# Altium project CM5_RP2040_MZM.PrjPcb (part 2 of 3)

## Sheet CM5_Boot_USB.SchDoc: 05 - CM5: boot, USB, UART, I2C e ventilacao
size A3; Project: CM5 Photonic Bias Controller; DocumentRev: R5; ProjectRev: R5; Version: Rev R6; SheetNumber: 6; SheetTotal: 17; Author: Carlos Renan; SCH_SCALE: N/A; Address1: UFCG; Address2: Referencia: VIRTUS CC; Address3: Campina Grande - PB; ProjectName: Controle automatico de BIAS para MZM/IQ - Projeto 3; DocumentName: CM5_Boot_USB.SchDoc
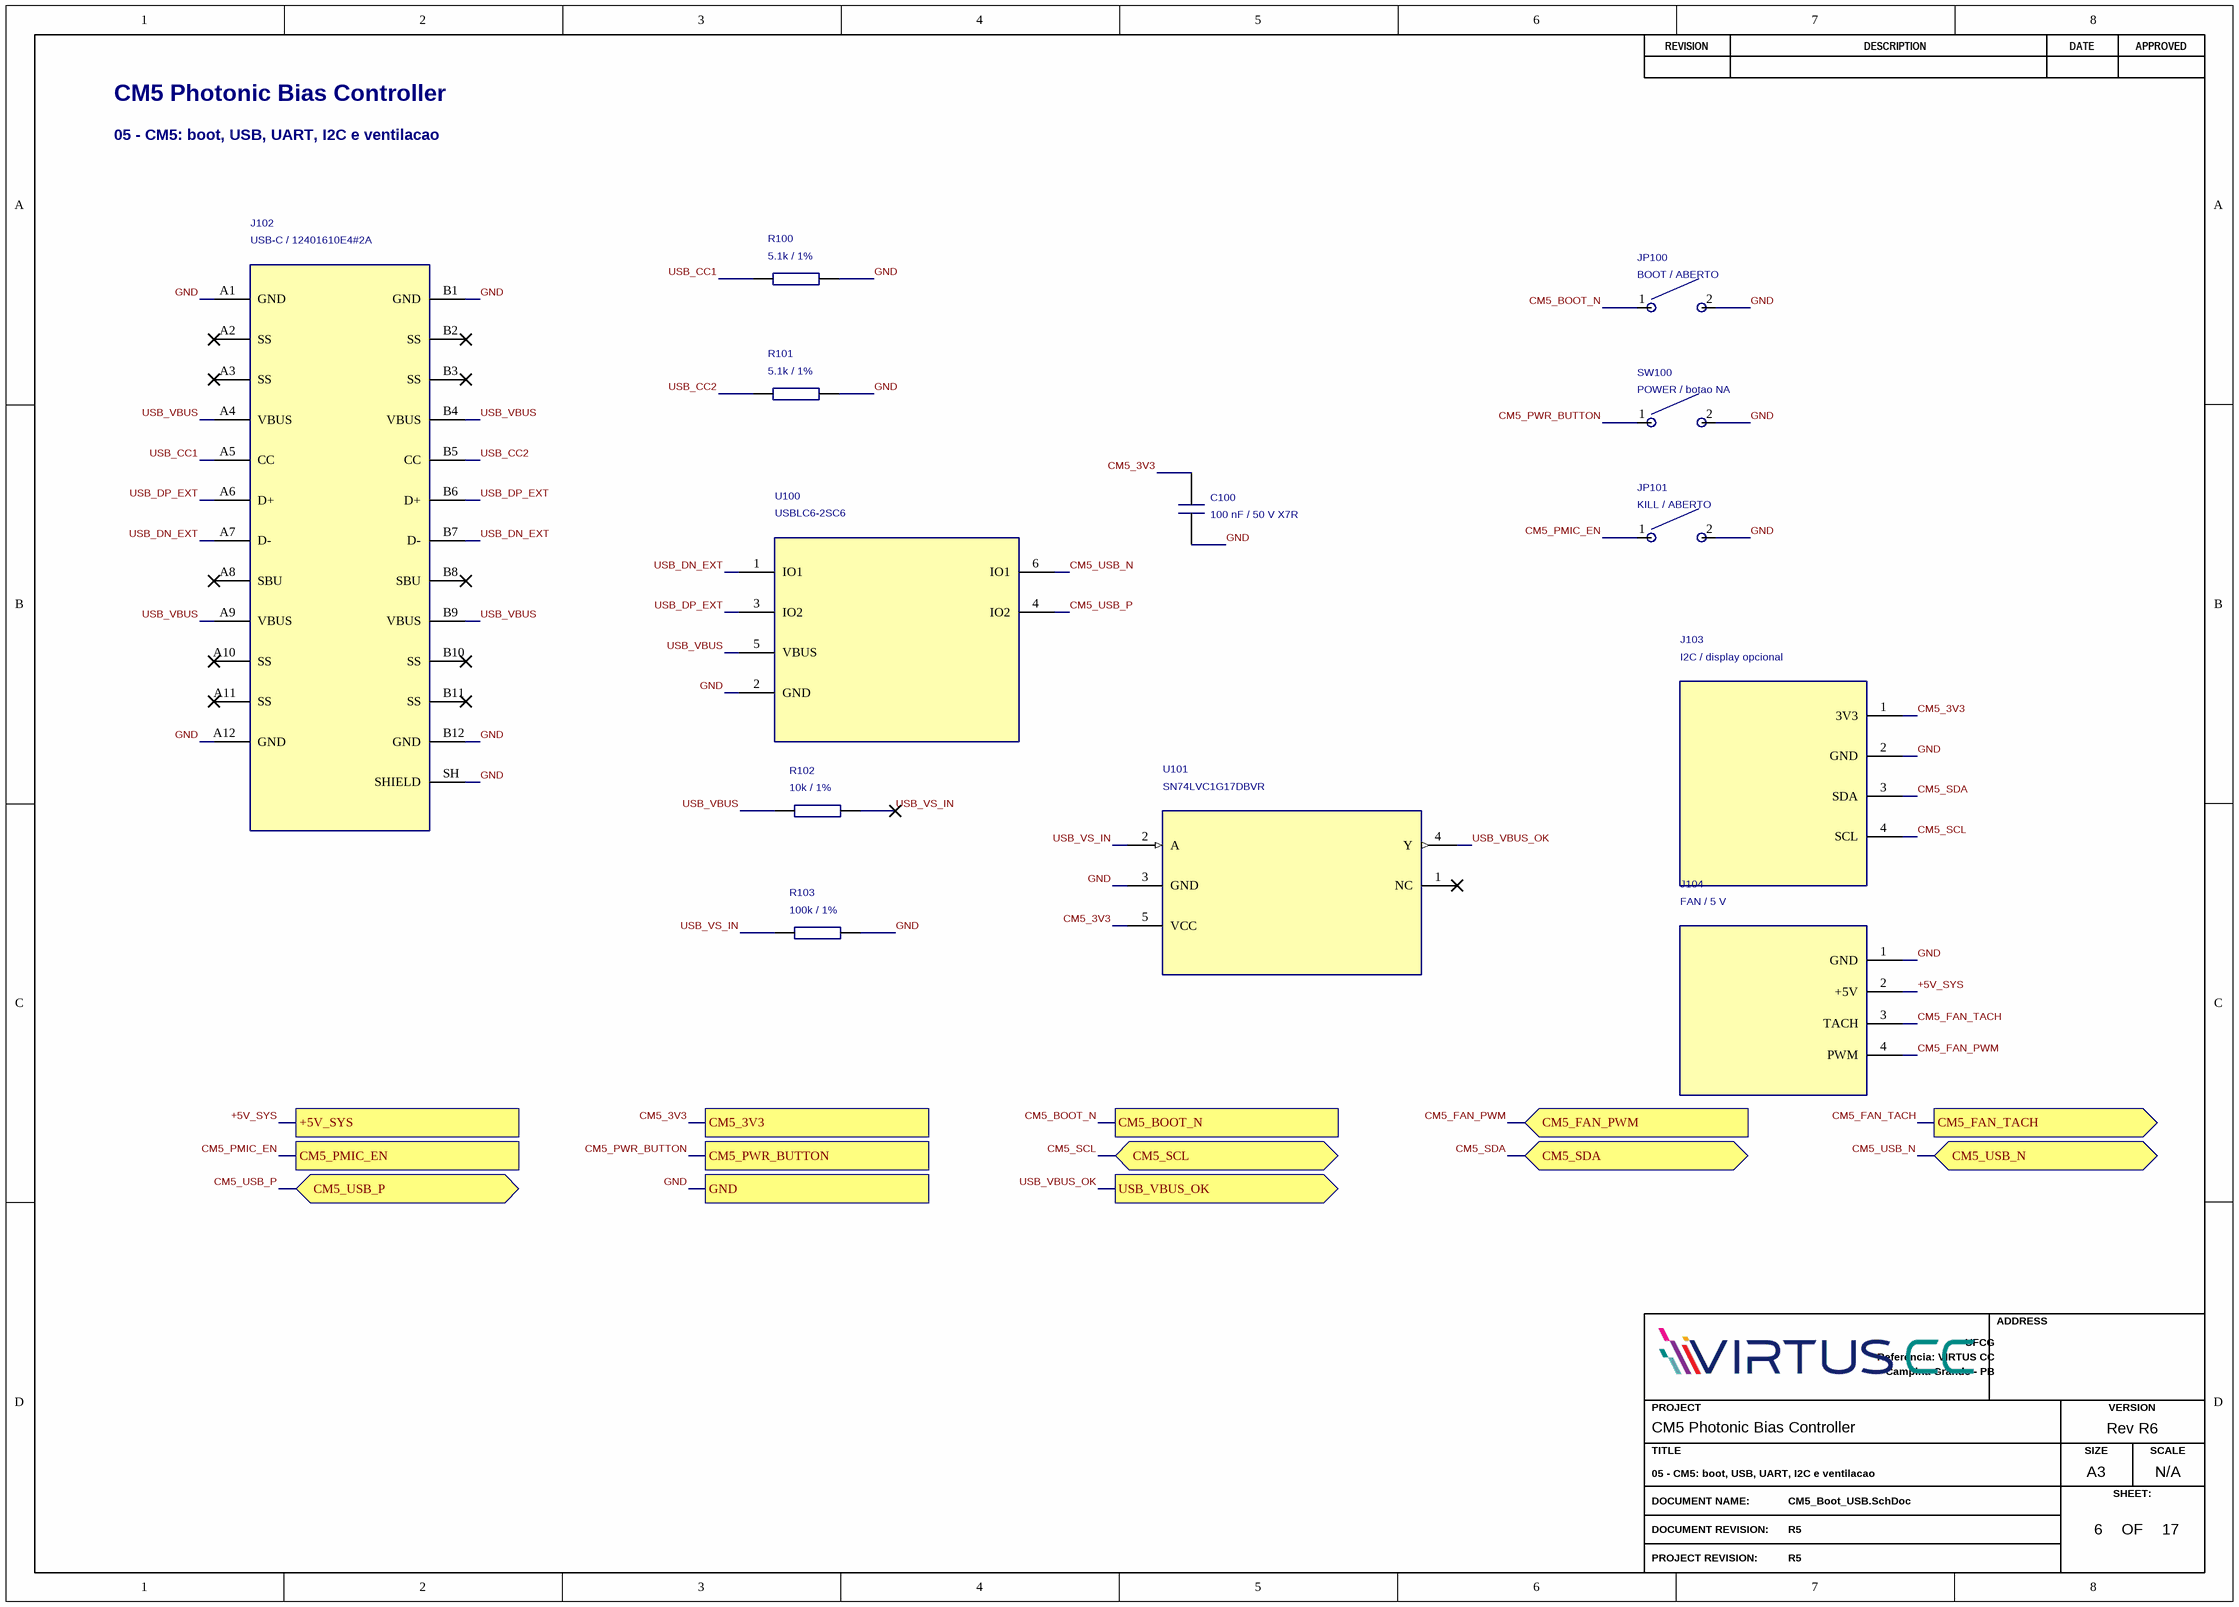
[diagram p8: CM5_Boot_USB.SchDoc]

### Parts
C100  100 nF / 50 V X7R  [C0805]
J102  USB-C / 12401610E4#2A  [USB_C_12401610]
J103  I2C / display opcional  [HDR_1X04_P254]
J104  FAN / 5 V  [HDR_1X04_P254]
JP100  BOOT / ABERTO  [HDR_1X02_P254]
JP101  KILL / ABERTO  [HDR_1X02_P254]
R100  5.1k / 1%  [R-0603]
R101  5.1k / 1%  [R-0603]
R102  10k / 1%  [R-0603]
R103  100k / 1%  [R-0603]
SW100  POWER / botao NA  [SW_TL3305A]
U100  USBLC6-2SC6  [SOT26]
U101  SN74LVC1G17DBVR  [FP-C04-091-OT-MFG]

### Ports
+5V_SYS, CM5_3V3, CM5_BOOT_N, CM5_FAN_PWM (in), CM5_FAN_TACH (out), CM5_PMIC_EN, CM5_PWR_BUTTON, CM5_SCL (bidir), CM5_SDA (bidir), CM5_USB_N (bidir), CM5_USB_P (bidir), GND, USB_VBUS_OK (out)

### Nets
GND: C100.2 J102.A1(GND) J102.A12(GND) J102.B1(GND) J102.B12(GND) J102.SH(SHIELD) J103.2(GND) J104.1(GND) JP100.2 JP101.2 R100.2 R101.2 R103.2 SW100.2 U100.2(GND) U101.3(GND) ; port GND
+5V_SYS: J104.2(+5V) ; port +5V_SYS
CM5_3V3: C100.1 J103.1(3V3) U101.5(VCC) ; port CM5_3V3
CM5_BOOT_N: JP100.1 ; port CM5_BOOT_N
CM5_FAN_PWM: J104.4(PWM) ; port CM5_FAN_PWM
CM5_FAN_TACH: J104.3(TACH) ; port CM5_FAN_TACH
CM5_PMIC_EN: JP101.1 ; port CM5_PMIC_EN
CM5_PWR_BUTTON: SW100.1 ; port CM5_PWR_BUTTON
CM5_SCL: J103.4(SCL) ; port CM5_SCL
CM5_SDA: J103.3(SDA) ; port CM5_SDA
CM5_USB_N: U100.6(IO1) ; port CM5_USB_N
CM5_USB_P: U100.4(IO2) ; port CM5_USB_P
USB_CC1: J102.A5(CC) R100.1
USB_CC2: J102.B5(CC) R101.1
USB_DN_EXT: J102.A7(D-) J102.B7(D-) U100.1(IO1)
USB_DP_EXT: J102.A6(D+) J102.B6(D+) U100.3(IO2)
USB_VBUS: J102.A4(VBUS) J102.A9(VBUS) J102.B4(VBUS) J102.B9(VBUS) R102.1 U100.5(VBUS)
USB_VBUS_OK: U101.4(Y) ; port USB_VBUS_OK
USB_VS_IN: R102.2 R103.1 U101.2(A)

Not connected (* = marked no-connect by the designer): J102 A2(SS)* A3(SS)* A8(SBU)* A10(SS)* A11(SS)* B2(SS)* B3(SS)* B8(SBU)* B10(SS)* B11(SS)*; U101 1(NC)*

### Notes on the sheet
- CM5 Photonic Bias Controller
- 05 - CM5: boot, USB, UART, I2C e ventilacao
- REVISION
- DESCRIPTION
- DATE
- APPROVED
- ADDRESS
- PROJECT
- VERSION
- TITLE
- A3
- SIZE
- SCALE
- DOCUMENT NAME:
- DOCUMENT REVISION:
- OF
- SHEET:
- PROJECT REVISION:

### Library data of the parts
C100 = 100 nF: as C202 on sheet Power_Input_5V; Manufacturer 1: KEMET; Manufacturer Part Number 1: C0805C104K5RACTU; Supplier 1: DigiKey; Supplier URL 1: https://www.digikey.com.br/pt/products/result?keywords=C0805C104K5RACTU; Supplier 2: Mouser; Supplier URL 2: https://br.mouser.com/c/?q=C0805C104K5RACTU; Datasheet: https://www.yageogroup.com/download/specsheet/C0805C104K5RACTU
J102 = USB-C: Manufacturer: Amphenol Communications Solutions; Review: 24 contatos; SuperSpeed e SBU NC. Somente USB2; os quatro pads da carcaca sao SH.; Procurement Status: Busca por MPN; SKU e disponibilidade a confirmar; BOM Purchase: Yes; Manufacturer Part Number: 12401610E4#2A; Manufacturer 1: Amphenol Communications Solutions; Manufacturer Part Number 1: 12401610E4#2A; Supplier 1: DigiKey; Supplier URL 1: https://www.digikey.com.br/pt/products/result?keywords=12401610E4%232A; Supplier 2: Mouser; Supplier Part Number 2: 523-12401610E4#2A; Supplier URL 2: https://br.mouser.com/c/?q=12401610E4%232A; Datasheet: https://cdn.amphenol-cs.com/media/wysiwyg/files/drawing/c12401610_c.pdf
J103 = I2C: Manufacturer: Wurth Elektronik; Manufacturer Part Number: 61300411121; Review: Header reto 1x4 sem chave. Conferir sequencia de pinos do cabo do fan; nao pressupor conector PC padrao.; Procurement Status: Busca por MPN; SKU e disponibilidade a confirmar; BOM Purchase: Yes; Manufacturer 1: Wurth Elektronik; Manufacturer Part Number 1: 61300411121; Supplier 1: DigiKey; Supplier URL 1: https://www.digikey.com.br/pt/products/result?keywords=61300411121; Supplier 2: Mouser; Supplier URL 2: https://br.mouser.com/c/?q=61300411121; Datasheet: https://www.we-online.com/components/products/datasheet/61300411121.pdf
J104 = FAN: Manufacturer: Wurth Elektronik; Manufacturer Part Number: 61300411121; Review: Header reto 1x4 sem chave. Conferir sequencia de pinos do cabo do fan; nao pressupor conector PC padrao.; Procurement Status: Busca por MPN; SKU e disponibilidade a confirmar; BOM Purchase: Yes; Manufacturer 1: Wurth Elektronik; Manufacturer Part Number 1: 61300411121; Supplier 1: DigiKey; Supplier URL 1: https://www.digikey.com.br/pt/products/result?keywords=61300411121; Supplier 2: Mouser; Supplier URL 2: https://br.mouser.com/c/?q=61300411121; Datasheet: https://www.we-online.com/components/products/datasheet/61300411121.pdf
JP100 = BOOT: Manufacturer: Wurth Elektronik; Manufacturer Part Number: 61300211121; Review: Header 1x2; shunt removivel listado como acessorio. SW1000 inicia aberto.; Procurement Status: Busca por MPN; SKU e disponibilidade a confirmar; BOM Purchase: Yes; Manufacturer 1: Wurth Elektronik; Manufacturer Part Number 1: 61300211121; Supplier 1: DigiKey; Supplier URL 1: https://www.digikey.com.br/pt/products/result?keywords=61300211121; Supplier 2: Mouser; Supplier URL 2: https://br.mouser.com/c/?q=61300211121; Datasheet: https://www.we-online.com/components/products/datasheet/61300211121.pdf
JP101 = KILL: Manufacturer: Wurth Elektronik; Manufacturer Part Number: 61300211121; Review: Header 1x2; shunt removivel listado como acessorio. SW1000 inicia aberto.; Procurement Status: Busca por MPN; SKU e disponibilidade a confirmar; BOM Purchase: Yes; Manufacturer 1: Wurth Elektronik; Manufacturer Part Number 1: 61300211121; Supplier 1: DigiKey; Supplier URL 1: https://www.digikey.com.br/pt/products/result?keywords=61300211121; Supplier 2: Mouser; Supplier URL 2: https://br.mouser.com/c/?q=61300211121; Datasheet: https://www.we-online.com/components/products/datasheet/61300211121.pdf
R100 R101 = 5.1k: Manufacturer: YAGEO; Manufacturer Part Number: RC0603FR-075K1L; Procurement Status: Busca por MPN; SKU e disponibilidade a confirmar; BOM Purchase: Yes; Manufacturer 1: YAGEO; Manufacturer Part Number 1: RC0603FR-075K1L; Supplier 1: DigiKey; Supplier URL 1: https://www.digikey.com.br/pt/products/result?keywords=RC0603FR-075K1L; Supplier 2: Mouser; Supplier URL 2: https://br.mouser.com/c/?q=RC0603FR-075K1L; Datasheet: https://www.yageo.com/en/Product/Index/rchip
R102 = 10k: Manufacturer: YAGEO; Manufacturer Part Number: RC0603FR-0710KL; Procurement Status: Busca por MPN; SKU e disponibilidade a confirmar; BOM Purchase: Yes; Manufacturer 1: YAGEO; Manufacturer Part Number 1: RC0603FR-0710KL; Supplier 1: DigiKey; Supplier URL 1: https://www.digikey.com.br/pt/products/result?keywords=RC0603FR-0710KL; Supplier 2: Mouser; Supplier URL 2: https://br.mouser.com/c/?q=RC0603FR-0710KL; Datasheet: https://www.yageo.com/en/Product/Index/rchip
R103 = 100k: Manufacturer: YAGEO; Manufacturer Part Number: RC0603FR-07100KL; Procurement Status: Busca por MPN; SKU e disponibilidade a confirmar; BOM Purchase: Yes; Manufacturer 1: YAGEO; Manufacturer Part Number 1: RC0603FR-07100KL; Supplier 1: DigiKey; Supplier URL 1: https://www.digikey.com.br/pt/products/result?keywords=RC0603FR-07100KL; Supplier 2: Mouser; Supplier URL 2: https://br.mouser.com/c/?q=RC0603FR-07100KL; Datasheet: https://www.yageo.com/en/Product/Index/rchip
SW100 = POWER: Manufacturer: E-Switch; Manufacturer Part Number: TL3305AF160QG; Review: Botao normalmente aberto; quatro pads fisicos, dois numeros eletricos repetidos.; Procurement Status: Busca por MPN; SKU e disponibilidade a confirmar; BOM Purchase: Yes; Manufacturer 1: E-Switch; Manufacturer Part Number 1: TL3305AF160QG; Supplier 1: DigiKey; Supplier URL 1: https://www.digikey.com.br/pt/products/result?keywords=TL3305AF160QG; Supplier 2: Mouser; Supplier URL 2: https://br.mouser.com/c/?q=TL3305AF160QG; Datasheet: https://www.e-switch.com/product-catalog/tl3305-series-tact-switch/
U100 = USBLC6-2SC6: Manufacturer: STMicroelectronics; Procurement Status: Busca por MPN; SKU e disponibilidade a confirmar; BOM Purchase: Yes; Manufacturer Part Number: USBLC6-2SC6; Manufacturer 1: STMicroelectronics; Manufacturer Part Number 1: USBLC6-2SC6; Supplier 1: DigiKey; Supplier URL 1: https://www.digikey.com.br/pt/products/result?keywords=USBLC6-2SC6; Supplier 2: Mouser; Supplier URL 2: https://br.mouser.com/c/?q=USBLC6-2SC6; Datasheet: https://www.st.com/resource/en/datasheet/usblc6-2.pdf
U101 = SN74LVC1G17DBVR: Manufacturer: Texas Instruments; Procurement Status: Busca por MPN; SKU e disponibilidade a confirmar; BOM Purchase: Yes; Manufacturer Part Number: SN74LVC1G17DBVR; Manufacturer 1: Texas Instruments; Manufacturer Part Number 1: SN74LVC1G17DBVR; Supplier 1: DigiKey; Supplier URL 1: https://www.digikey.com.br/pt/products/result?keywords=SN74LVC1G17DBVR; Supplier 2: Mouser; Supplier URL 2: https://br.mouser.com/c/?q=SN74LVC1G17DBVR; Datasheet: https://www.ti.com/lit/ds/symlink/sn74lvc1g17.pdf

## Sheet MCU_RP2040.SchDoc: 06 - Controlador deterministico RP2040
size A3; Project: CM5 Photonic Bias Controller; DocumentRev: R5; ProjectRev: R5; Version: Rev R6; SheetNumber: 7; SheetTotal: 17; Author: Carlos Renan; SCH_SCALE: N/A; Address1: UFCG; Address2: Referencia: VIRTUS CC; Address3: Campina Grande - PB; ProjectName: Controle automatico de BIAS para MZM/IQ - Projeto 3; DocumentName: MCU_RP2040.SchDoc
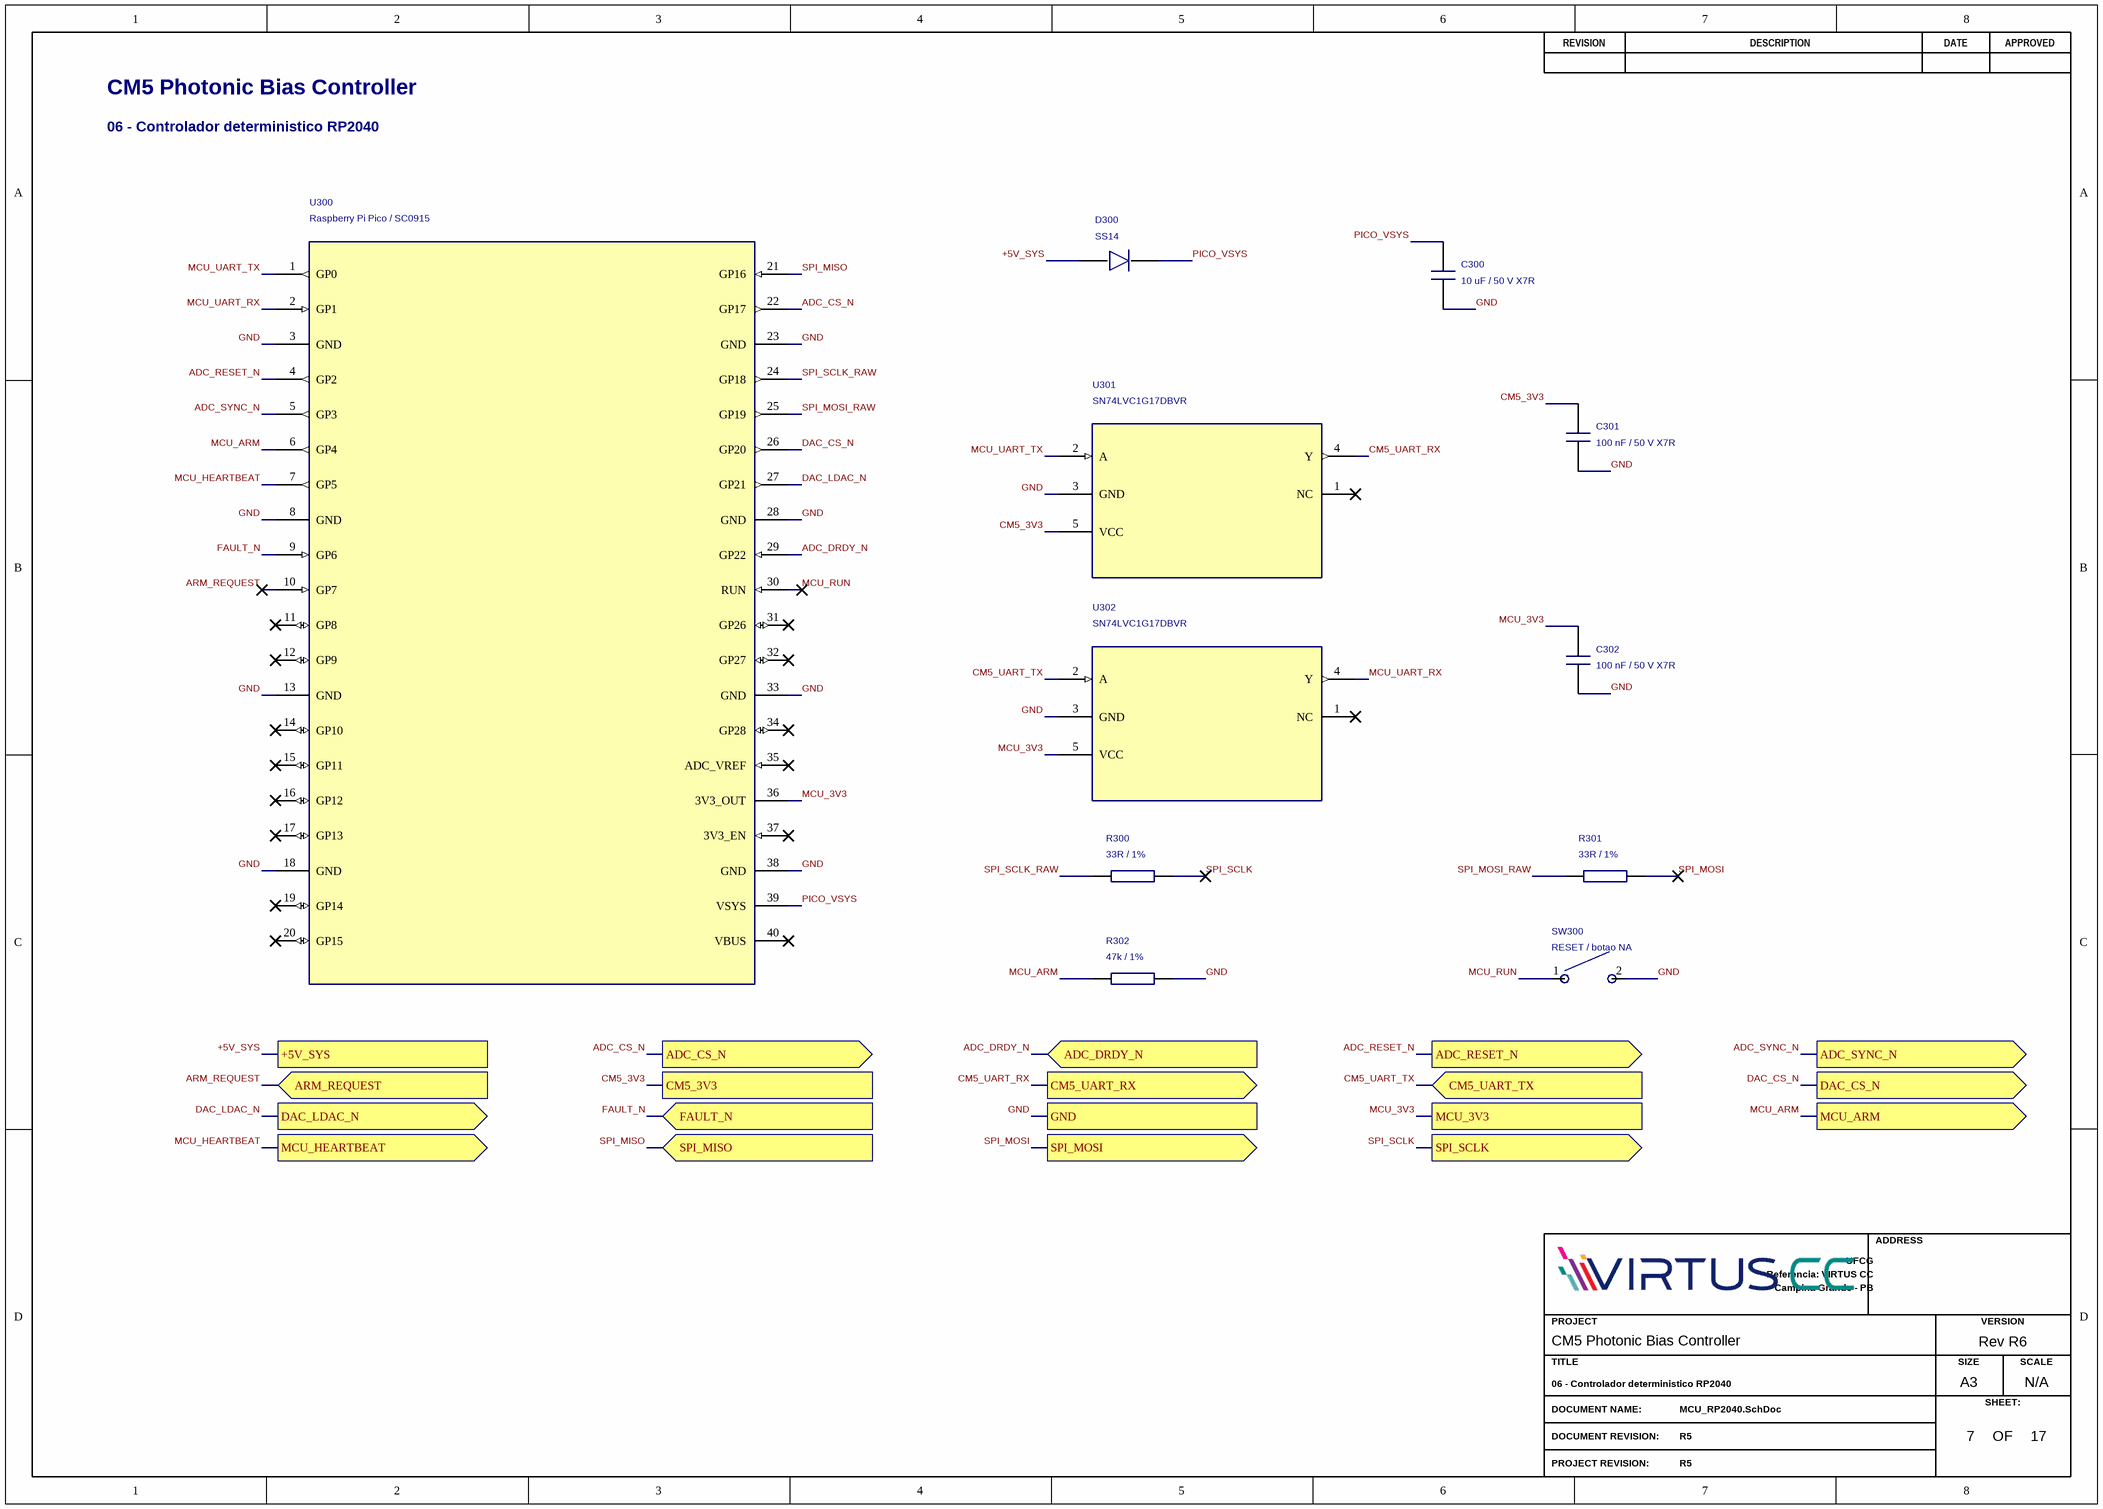
[diagram p9: MCU_RP2040.SchDoc]

### Parts
C300  10 uF / 50 V X7R  [C1210]
C301  100 nF / 50 V X7R  [C0805]
C302  100 nF / 50 V X7R  [C0805]
D300  SS14  [DO-214AC]
R300  33R / 1%  [R-0603]
R301  33R / 1%  [R-0603]
R302  47k / 1%  [R-0603]
SW300  RESET / botao NA  [SW_TL3305A]
U300  Raspberry Pi Pico / SC0915  [PICO_TH40]
U301  SN74LVC1G17DBVR  [FP-C04-091-OT-MFG]
U302  SN74LVC1G17DBVR  [FP-C04-091-OT-MFG]

### Ports
+5V_SYS, ADC_CS_N (out), ADC_DRDY_N (in), ADC_RESET_N (out), ADC_SYNC_N (out), ARM_REQUEST (in), CM5_3V3, CM5_UART_RX (out), CM5_UART_TX (in), DAC_CS_N (out), DAC_LDAC_N (out), FAULT_N (in), GND, MCU_3V3, MCU_ARM (out), MCU_HEARTBEAT (out), SPI_MISO (in), SPI_MOSI (out), SPI_SCLK (out)

### Nets
GND: C300.2 C301.2 C302.2 R302.2 SW300.2 U300.3(GND) U300.8(GND) U300.13(GND) U300.18(GND) U300.23(GND) U300.28(GND) U300.33(GND) U300.38(GND) U301.3(GND) U302.3(GND) ; port GND
+5V_SYS: D300.2(A) ; port +5V_SYS
ADC_CS_N: U300.22(GP17) ; port ADC_CS_N
ADC_DRDY_N: U300.29(GP22) ; port ADC_DRDY_N
ADC_RESET_N: U300.4(GP2) ; port ADC_RESET_N
ADC_SYNC_N: U300.5(GP3) ; port ADC_SYNC_N
ARM_REQUEST: U300.10(GP7) ; port ARM_REQUEST
CM5_3V3: C301.1 U301.5(VCC) ; port CM5_3V3
CM5_UART_RX: U301.4(Y) ; port CM5_UART_RX
CM5_UART_TX: U302.2(A) ; port CM5_UART_TX
DAC_CS_N: U300.26(GP20) ; port DAC_CS_N
DAC_LDAC_N: U300.27(GP21) ; port DAC_LDAC_N
FAULT_N: U300.9(GP6) ; port FAULT_N
MCU_3V3: C302.1 U300.36(3V3_OUT) U302.5(VCC) ; port MCU_3V3
MCU_ARM: R302.1 U300.6(GP4) ; port MCU_ARM
MCU_HEARTBEAT: U300.7(GP5) ; port MCU_HEARTBEAT
MCU_RUN: SW300.1 U300.30(RUN)
MCU_UART_RX: U300.2(GP1) U302.4(Y)
MCU_UART_TX: U300.1(GP0) U301.2(A)
PICO_VSYS: C300.1 D300.1(K) U300.39(VSYS)
SPI_MISO: U300.21(GP16) ; port SPI_MISO
SPI_MOSI: R301.2 ; port SPI_MOSI
SPI_MOSI_RAW: R301.1 U300.25(GP19)
SPI_SCLK: R300.2 ; port SPI_SCLK
SPI_SCLK_RAW: R300.1 U300.24(GP18)

Not connected (* = marked no-connect by the designer): U300 11(GP8)* 12(GP9)* 14(GP10)* 15(GP11)* 16(GP12)* 17(GP13)* 19(GP14)* 20(GP15)* 31(GP26)* 32(GP27)* 34(GP28)* 35(ADC_VREF)* 37(3V3_EN)* 40(VBUS)*; U301 1(NC)*; U302 1(NC)*

### Notes on the sheet
- CM5 Photonic Bias Controller
- 06 - Controlador deterministico RP2040
- REVISION
- DESCRIPTION
- DATE
- APPROVED
- ADDRESS
- PROJECT
- VERSION
- TITLE
- A3
- SIZE
- SCALE
- DOCUMENT NAME:
- DOCUMENT REVISION:
- OF
- SHEET:
- PROJECT REVISION:

### Library data of the parts
C300 = 10 uF: Manufacturer: KEMET; Manufacturer Part Number: C1210C106K5RACTU; Procurement Status: Busca por MPN; SKU e disponibilidade a confirmar; BOM Purchase: Yes; Manufacturer 1: KEMET; Manufacturer Part Number 1: C1210C106K5RACTU; Supplier 1: DigiKey; Supplier URL 1: https://www.digikey.com.br/pt/products/result?keywords=C1210C106K5RACTU; Supplier 2: Mouser; Supplier URL 2: https://br.mouser.com/c/?q=C1210C106K5RACTU; Datasheet: https://www.yageogroup.com/download/specsheet/C1210C106K5RACTU
C301 C302 = 100 nF: as C202 on sheet Power_Input_5V; Manufacturer 1: KEMET; Manufacturer Part Number 1: C0805C104K5RACTU; Supplier 1: DigiKey; Supplier URL 1: https://www.digikey.com.br/pt/products/result?keywords=C0805C104K5RACTU; Supplier 2: Mouser; Supplier URL 2: https://br.mouser.com/c/?q=C0805C104K5RACTU; Datasheet: https://www.yageogroup.com/download/specsheet/C0805C104K5RACTU
D300 = SS14: Manufacturer: Diodes Incorporated; Manufacturer Part Number: SS14-13-F; Procurement Status: Busca por MPN; SKU e disponibilidade a confirmar; BOM Purchase: Yes; Manufacturer 1: Diodes Incorporated; Manufacturer Part Number 1: SS14-13-F; Supplier 1: DigiKey; Supplier URL 1: https://www.digikey.com.br/pt/products/result?keywords=SS14-13-F; Supplier 2: Mouser; Supplier URL 2: https://br.mouser.com/c/?q=SS14-13-F; Datasheet: https://www.diodes.com/datasheet/download/SS12.pdf
R300 R301 = 33R: Manufacturer: YAGEO; Manufacturer Part Number: RC0603FR-0733RL; Procurement Status: Busca por MPN; SKU e disponibilidade a confirmar; BOM Purchase: Yes; Manufacturer 1: YAGEO; Manufacturer Part Number 1: RC0603FR-0733RL; Supplier 1: DigiKey; Supplier URL 1: https://www.digikey.com.br/pt/products/result?keywords=RC0603FR-0733RL; Supplier 2: Mouser; Supplier URL 2: https://br.mouser.com/c/?q=RC0603FR-0733RL; Datasheet: https://www.yageo.com/en/Product/Index/rchip
R302 = 47k: Manufacturer: YAGEO; Manufacturer Part Number: RC0603FR-0747KL; Procurement Status: Busca por MPN; SKU e disponibilidade a confirmar; BOM Purchase: Yes; Manufacturer 1: YAGEO; Manufacturer Part Number 1: RC0603FR-0747KL; Supplier 1: DigiKey; Supplier URL 1: https://www.digikey.com.br/pt/products/result?keywords=RC0603FR-0747KL; Supplier 2: Mouser; Supplier URL 2: https://br.mouser.com/c/?q=RC0603FR-0747KL; Datasheet: https://www.yageo.com/en/Product/Index/rchip
SW300 = RESET: Manufacturer: E-Switch; Manufacturer Part Number: TL3305AF160QG; Review: Botao normalmente aberto; quatro pads fisicos, dois numeros eletricos repetidos.; Procurement Status: Busca por MPN; SKU e disponibilidade a confirmar; BOM Purchase: Yes; Manufacturer 1: E-Switch; Manufacturer Part Number 1: TL3305AF160QG; Supplier 1: DigiKey; Supplier URL 1: https://www.digikey.com.br/pt/products/result?keywords=TL3305AF160QG; Supplier 2: Mouser; Supplier URL 2: https://br.mouser.com/c/?q=TL3305AF160QG; Datasheet: https://www.e-switch.com/product-catalog/tl3305-series-tact-switch/
U300 = Raspberry Pi Pico: Review: Montagem THT com dois headers de 20 vias incluidos na lista de acessorios; sem pads SMT sob o modulo.; Procurement Status: Busca por MPN; SKU e disponibilidade a confirmar; BOM Purchase: Yes; Manufacturer: Raspberry Pi; Manufacturer Part Number: SC0915; Manufacturer 1: Raspberry Pi; Manufacturer Part Number 1: SC0915; Supplier 1: DigiKey; Supplier URL 1: https://www.digikey.com.br/pt/products/result?keywords=SC0915; Supplier 2: Mouser; Supplier URL 2: https://br.mouser.com/c/?q=SC0915; Datasheet: https://datasheets.raspberrypi.com/pico/pico-datasheet.pdf
U301 U302 = SN74LVC1G17DBVR: as U101 on sheet CM5_Boot_USB; Manufacturer Part Number: SN74LVC1G17DBVR; Manufacturer 1: Texas Instruments; Manufacturer Part Number 1: SN74LVC1G17DBVR; Supplier 1: DigiKey; Supplier URL 1: https://www.digikey.com.br/pt/products/result?keywords=SN74LVC1G17DBVR; Supplier 2: Mouser; Supplier URL 2: https://br.mouser.com/c/?q=SN74LVC1G17DBVR; Datasheet: https://www.ti.com/lit/ds/symlink/sn74lvc1g17.pdf

## Sheet ADC.SchDoc: 07 - Aquisicao do fotodetector e monitores
size A3; Project: CM5 Photonic Bias Controller; DocumentRev: R5; ProjectRev: R5; Version: Rev R6; SheetNumber: 8; SheetTotal: 17; Author: Carlos Renan; SCH_SCALE: N/A; Address1: UFCG; Address2: Referencia: VIRTUS CC; Address3: Campina Grande - PB; ProjectName: Controle automatico de BIAS para MZM/IQ - Projeto 3; DocumentName: ADC.SchDoc
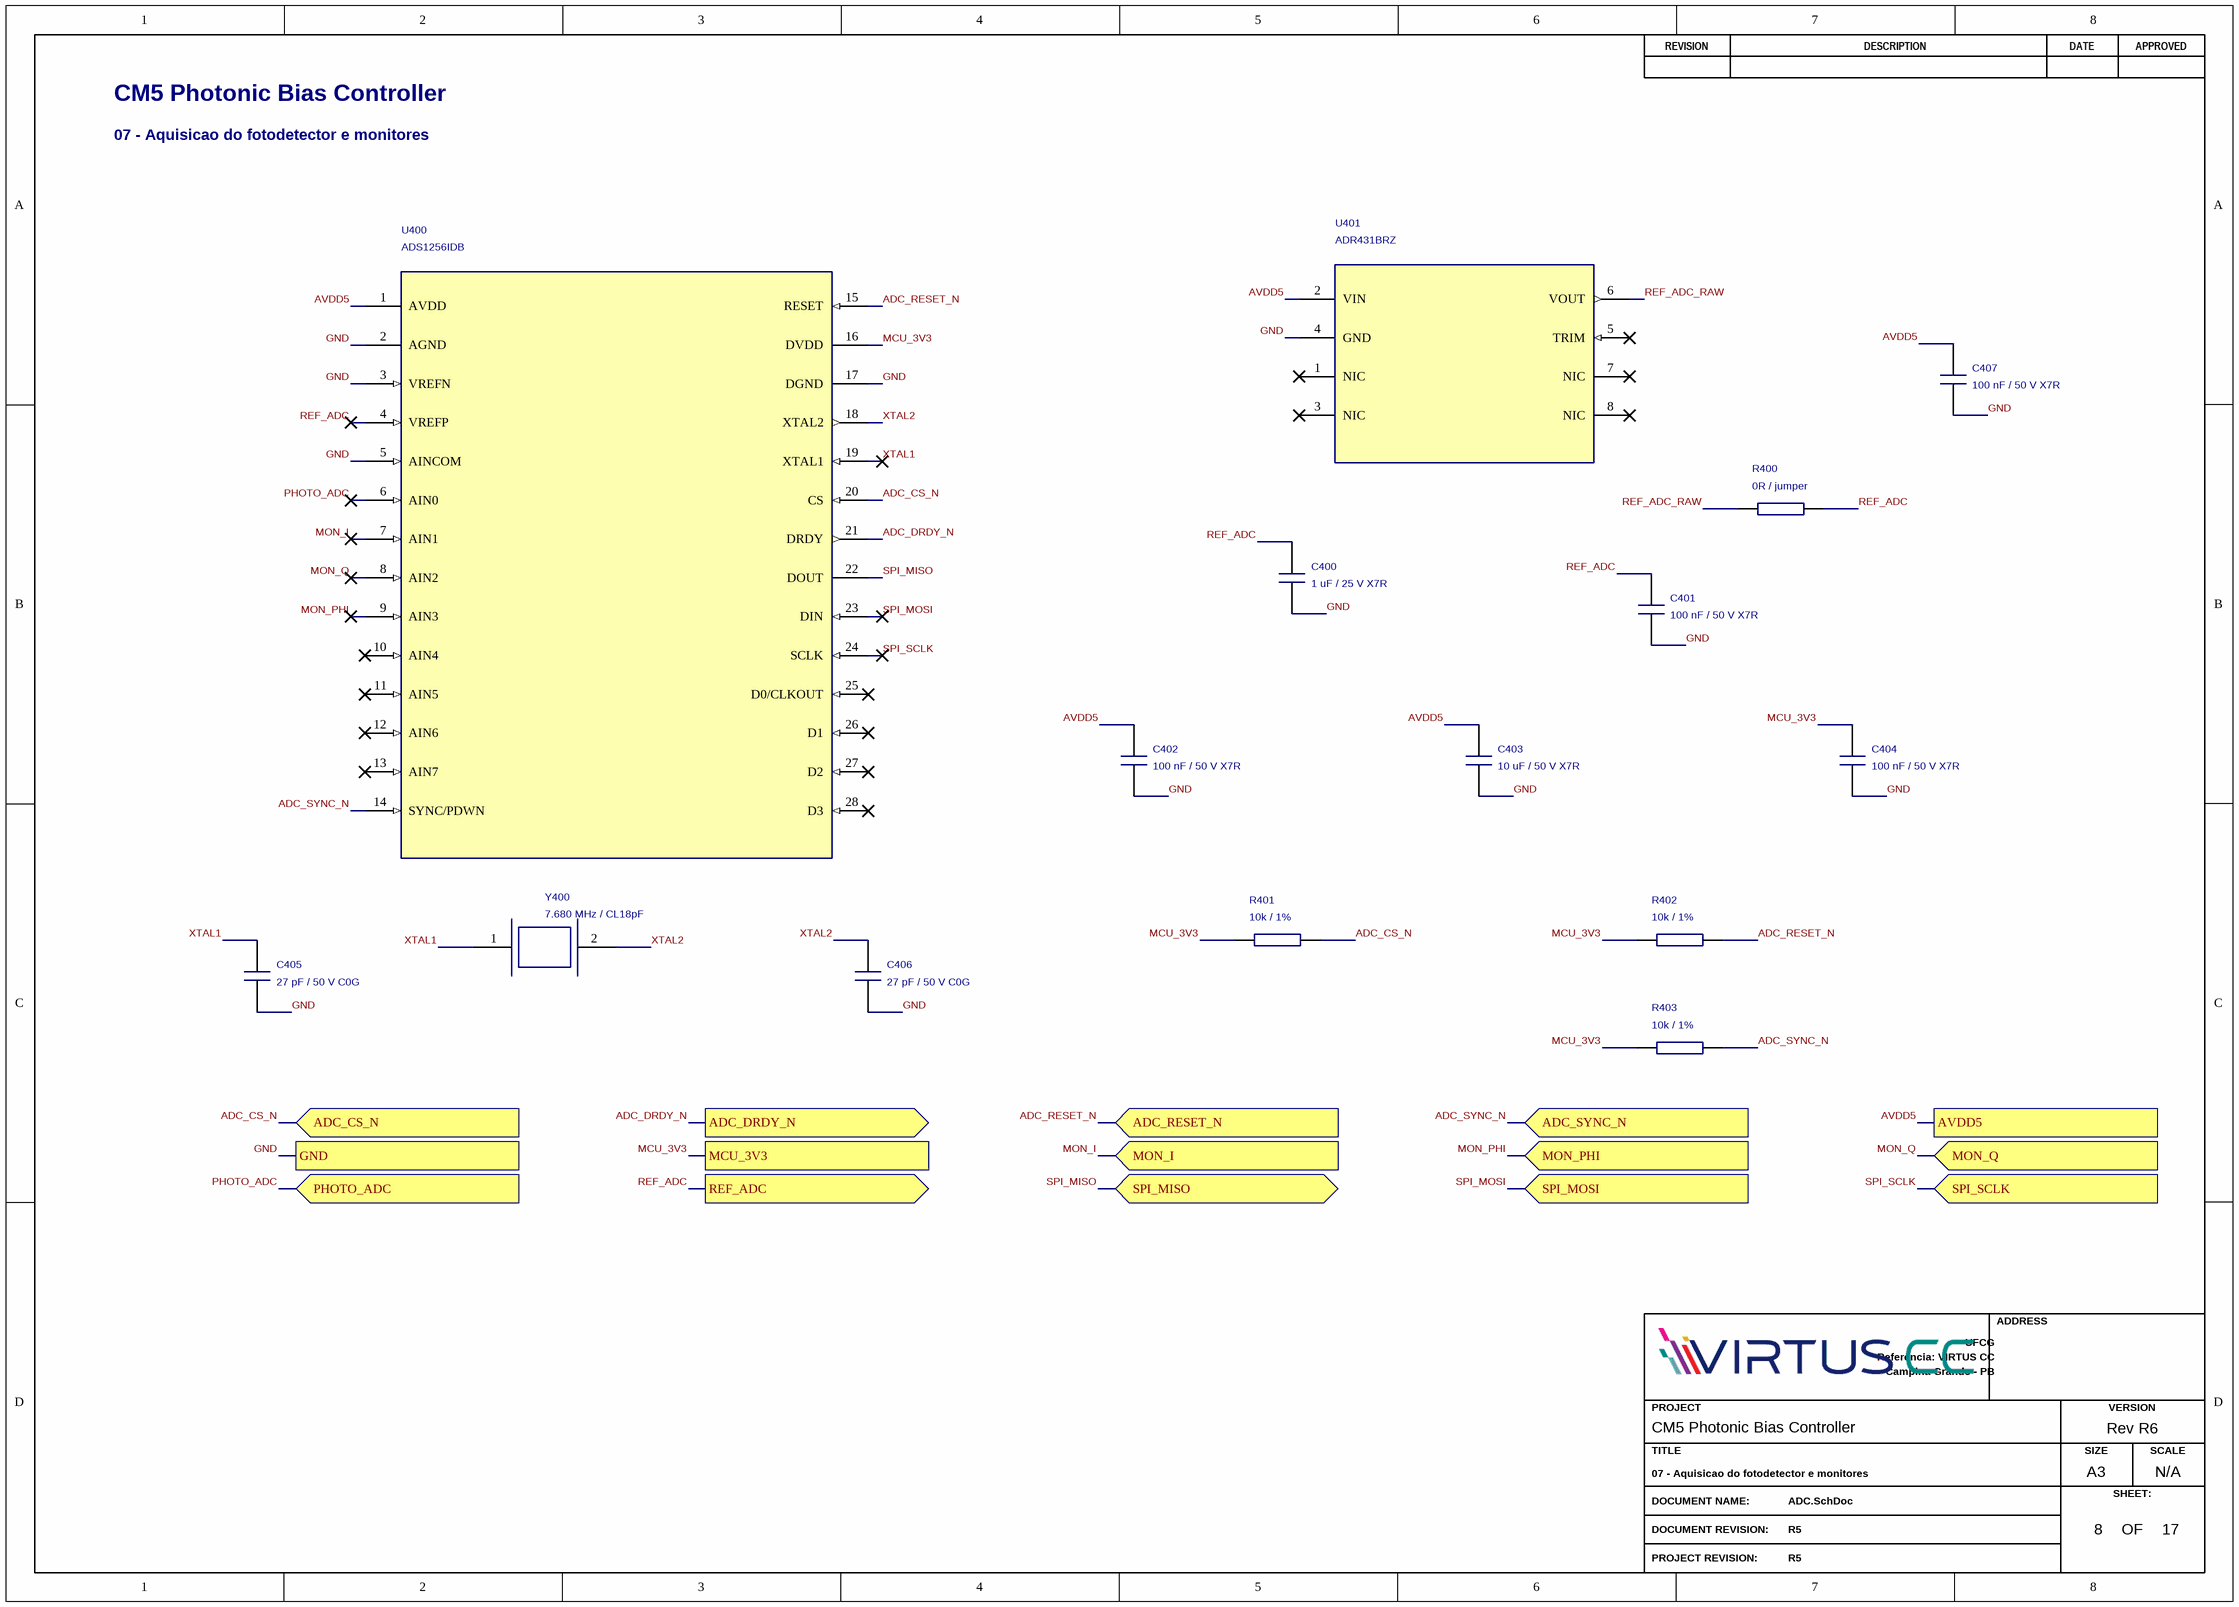
[diagram p10: ADC.SchDoc]

### Parts
C400  1 uF / 25 V X7R  [C0805]
C401  100 nF / 50 V X7R  [C0805]
C402  100 nF / 50 V X7R  [C0805]
C403  10 uF / 50 V X7R  [C1210]
C404  100 nF / 50 V X7R  [C0805]
C405  27 pF / 50 V C0G  [C0805]
C406  27 pF / 50 V C0G  [C0805]
C407  100 nF / 50 V X7R  [C0805]
R400  0R / jumper  [R-0603]
R401  10k / 1%  [R-0603]
R402  10k / 1%  [R-0603]
R403  10k / 1%  [R-0603]
U400  ADS1256IDB  [SSOP28_DB]
U401  ADR431BRZ  [SOIC8]
Y400  7.680 MHz / CL18pF  [XTAL_HC49]

### Ports
ADC_CS_N (in), ADC_DRDY_N (out), ADC_RESET_N (in), ADC_SYNC_N (in), AVDD5, GND, MCU_3V3, MON_I (in), MON_PHI (in), MON_Q (in), PHOTO_ADC (in), REF_ADC (out), SPI_MISO (bidir), SPI_MOSI (in), SPI_SCLK (in)

### Nets
AVDD5: C402.1 C403.1 C407.1 U400.1(AVDD) U401.2(VIN) ; port AVDD5
GND: C400.2 C401.2 C402.2 C403.2 C404.2 C405.2 C406.2 C407.2 U400.2(AGND) U400.3(VREFN) U400.5(AINCOM) U400.17(DGND) U401.4(GND) ; port GND
ADC_CS_N: R401.2 U400.20(CS) ; port ADC_CS_N
ADC_DRDY_N: U400.21(DRDY) ; port ADC_DRDY_N
ADC_RESET_N: R402.2 U400.15(RESET) ; port ADC_RESET_N
ADC_SYNC_N: R403.2 U400.14(SYNC/PDWN) ; port ADC_SYNC_N
MCU_3V3: C404.1 R401.1 R402.1 R403.1 U400.16(DVDD) ; port MCU_3V3
MON_I: U400.7(AIN1) ; port MON_I
MON_PHI: U400.9(AIN3) ; port MON_PHI
MON_Q: U400.8(AIN2) ; port MON_Q
PHOTO_ADC: U400.6(AIN0) ; port PHOTO_ADC
REF_ADC: C400.1 C401.1 R400.2 U400.4(VREFP) ; port REF_ADC
REF_ADC_RAW: R400.1 U401.6(VOUT)
SPI_MISO: U400.22(DOUT) ; port SPI_MISO
SPI_MOSI: U400.23(DIN) ; port SPI_MOSI
SPI_SCLK: U400.24(SCLK) ; port SPI_SCLK
XTAL1: C405.1 U400.19(XTAL1) Y400.1
XTAL2: C406.1 U400.18(XTAL2) Y400.2

Not connected (* = marked no-connect by the designer): U400 10(AIN4)* 11(AIN5)* 12(AIN6)* 13(AIN7)* 25(D0/CLKOUT)* 26(D1)* 27(D2)* 28(D3)*; U401 1(NIC)* 3(NIC)* 5(TRIM)* 7(NIC)* 8(NIC)*

### Notes on the sheet
- CM5 Photonic Bias Controller
- 07 - Aquisicao do fotodetector e monitores
- REVISION
- DESCRIPTION
- DATE
- APPROVED
- ADDRESS
- PROJECT
- VERSION
- TITLE
- A3
- SIZE
- SCALE
- DOCUMENT NAME:
- DOCUMENT REVISION:
- OF
- SHEET:
- PROJECT REVISION:

### Library data of the parts
C400 = 1 uF: Manufacturer: KEMET; Manufacturer Part Number: C0805C105K3RACTU; Procurement Status: Busca por MPN; SKU e disponibilidade a confirmar; BOM Purchase: Yes; Manufacturer 1: KEMET; Manufacturer Part Number 1: C0805C105K3RACTU; Supplier 1: DigiKey; Supplier URL 1: https://www.digikey.com.br/pt/products/result?keywords=C0805C105K3RACTU; Supplier 2: Mouser; Supplier URL 2: https://br.mouser.com/c/?q=C0805C105K3RACTU; Datasheet: https://www.yageogroup.com/download/specsheet/C0805C105K3RACTU
C401 C402 C404 C407 = 100 nF: as C202 on sheet Power_Input_5V; Manufacturer 1: KEMET; Manufacturer Part Number 1: C0805C104K5RACTU; Supplier 1: DigiKey; Supplier URL 1: https://www.digikey.com.br/pt/products/result?keywords=C0805C104K5RACTU; Supplier 2: Mouser; Supplier URL 2: https://br.mouser.com/c/?q=C0805C104K5RACTU; Datasheet: https://www.yageogroup.com/download/specsheet/C0805C104K5RACTU
C403 = 10 uF: as C300 on sheet MCU_RP2040; Manufacturer 1: KEMET; Manufacturer Part Number 1: C1210C106K5RACTU; Supplier 1: DigiKey; Supplier URL 1: https://www.digikey.com.br/pt/products/result?keywords=C1210C106K5RACTU; Supplier 2: Mouser; Supplier URL 2: https://br.mouser.com/c/?q=C1210C106K5RACTU; Datasheet: https://www.yageogroup.com/download/specsheet/C1210C106K5RACTU
C405 C406 = 27 pF: Manufacturer: KEMET; Manufacturer Part Number: C0805C270J5GACTU; Procurement Status: Busca por MPN; SKU e disponibilidade a confirmar; BOM Purchase: Yes; Manufacturer 1: KEMET; Manufacturer Part Number 1: C0805C270J5GACTU; Supplier 1: DigiKey; Supplier URL 1: https://www.digikey.com.br/pt/products/result?keywords=C0805C270J5GACTU; Supplier 2: Mouser; Supplier URL 2: https://br.mouser.com/c/?q=C0805C270J5GACTU; Datasheet: https://www.yageogroup.com/download/specsheet/C0805C270J5GACTU
R400 = 0R: Manufacturer: YAGEO; Manufacturer Part Number: RC0603JR-070RL; Procurement Status: Busca por MPN; SKU e disponibilidade a confirmar; BOM Purchase: Yes; Manufacturer 1: YAGEO; Manufacturer Part Number 1: RC0603JR-070RL; Supplier 1: DigiKey; Supplier URL 1: https://www.digikey.com.br/pt/products/result?keywords=RC0603JR-070RL; Supplier 2: Mouser; Supplier URL 2: https://br.mouser.com/c/?q=RC0603JR-070RL; Datasheet: https://www.yageo.com/en/Product/Index/rchip
R401-R403 = 10k: as R102 on sheet CM5_Boot_USB; Manufacturer 1: YAGEO; Manufacturer Part Number 1: RC0603FR-0710KL; Supplier 1: DigiKey; Supplier URL 1: https://www.digikey.com.br/pt/products/result?keywords=RC0603FR-0710KL; Supplier 2: Mouser; Supplier URL 2: https://br.mouser.com/c/?q=RC0603FR-0710KL; Datasheet: https://www.yageo.com/en/Product/Index/rchip
U400 = ADS1256IDB: Manufacturer: Texas Instruments; Procurement Status: Busca por MPN; SKU e disponibilidade a confirmar; BOM Purchase: Yes; Manufacturer Part Number: ADS1256IDB; Manufacturer 1: Texas Instruments; Manufacturer Part Number 1: ADS1256IDB; Supplier 1: DigiKey; Supplier URL 1: https://www.digikey.com.br/pt/products/result?keywords=ADS1256IDB; Supplier 2: Mouser; Supplier URL 2: https://br.mouser.com/c/?q=ADS1256IDB; Datasheet: https://www.ti.com/lit/ds/symlink/ads1256.pdf
U401 = ADR431BRZ: Manufacturer: Analog Devices; Procurement Status: Busca por MPN; SKU e disponibilidade a confirmar; BOM Purchase: Yes; Manufacturer Part Number: ADR431BRZ; Manufacturer 1: Analog Devices; Manufacturer Part Number 1: ADR431BRZ; Supplier 1: DigiKey; Supplier URL 1: https://www.digikey.com.br/pt/products/result?keywords=ADR431BRZ; Supplier 2: Mouser; Supplier URL 2: https://br.mouser.com/c/?q=ADR431BRZ; Datasheet: https://www.analog.com/media/en/technical-documentation/data-sheets/ADR430_431_433_434_435.pdf
Y400 = 7.680 MHz: Manufacturer: Abracon; Manufacturer Part Number: ABLS-7.680MHZ-B2-T; Review: CL 18 pF; 27 pF externos sao iniciais. Ajustar aos parasitas e verificar oscilacao.; Procurement Status: Busca por MPN; SKU e disponibilidade a confirmar; BOM Purchase: Yes; Manufacturer 1: Abracon; Manufacturer Part Number 1: ABLS-7.680MHZ-B2-T; Supplier 1: DigiKey; Supplier URL 1: https://www.digikey.com.br/pt/products/result?keywords=ABLS-7.680MHZ-B2-T; Supplier 2: Mouser; Supplier URL 2: https://br.mouser.com/c/?q=ABLS-7.680MHZ-B2-T; Datasheet: https://abracon.com/Resonators/abls.pdf

## Sheet TIA.SchDoc: 08 - Fotodeteccao InGaAs e filtro
size A3; Project: CM5 Photonic Bias Controller; DocumentRev: R5; ProjectRev: R5; Version: Rev R6; SheetNumber: 9; SheetTotal: 17; Author: Carlos Renan; SCH_SCALE: N/A; Address1: UFCG; Address2: Referencia: VIRTUS CC; Address3: Campina Grande - PB; ProjectName: Controle automatico de BIAS para MZM/IQ - Projeto 3; DocumentName: TIA.SchDoc
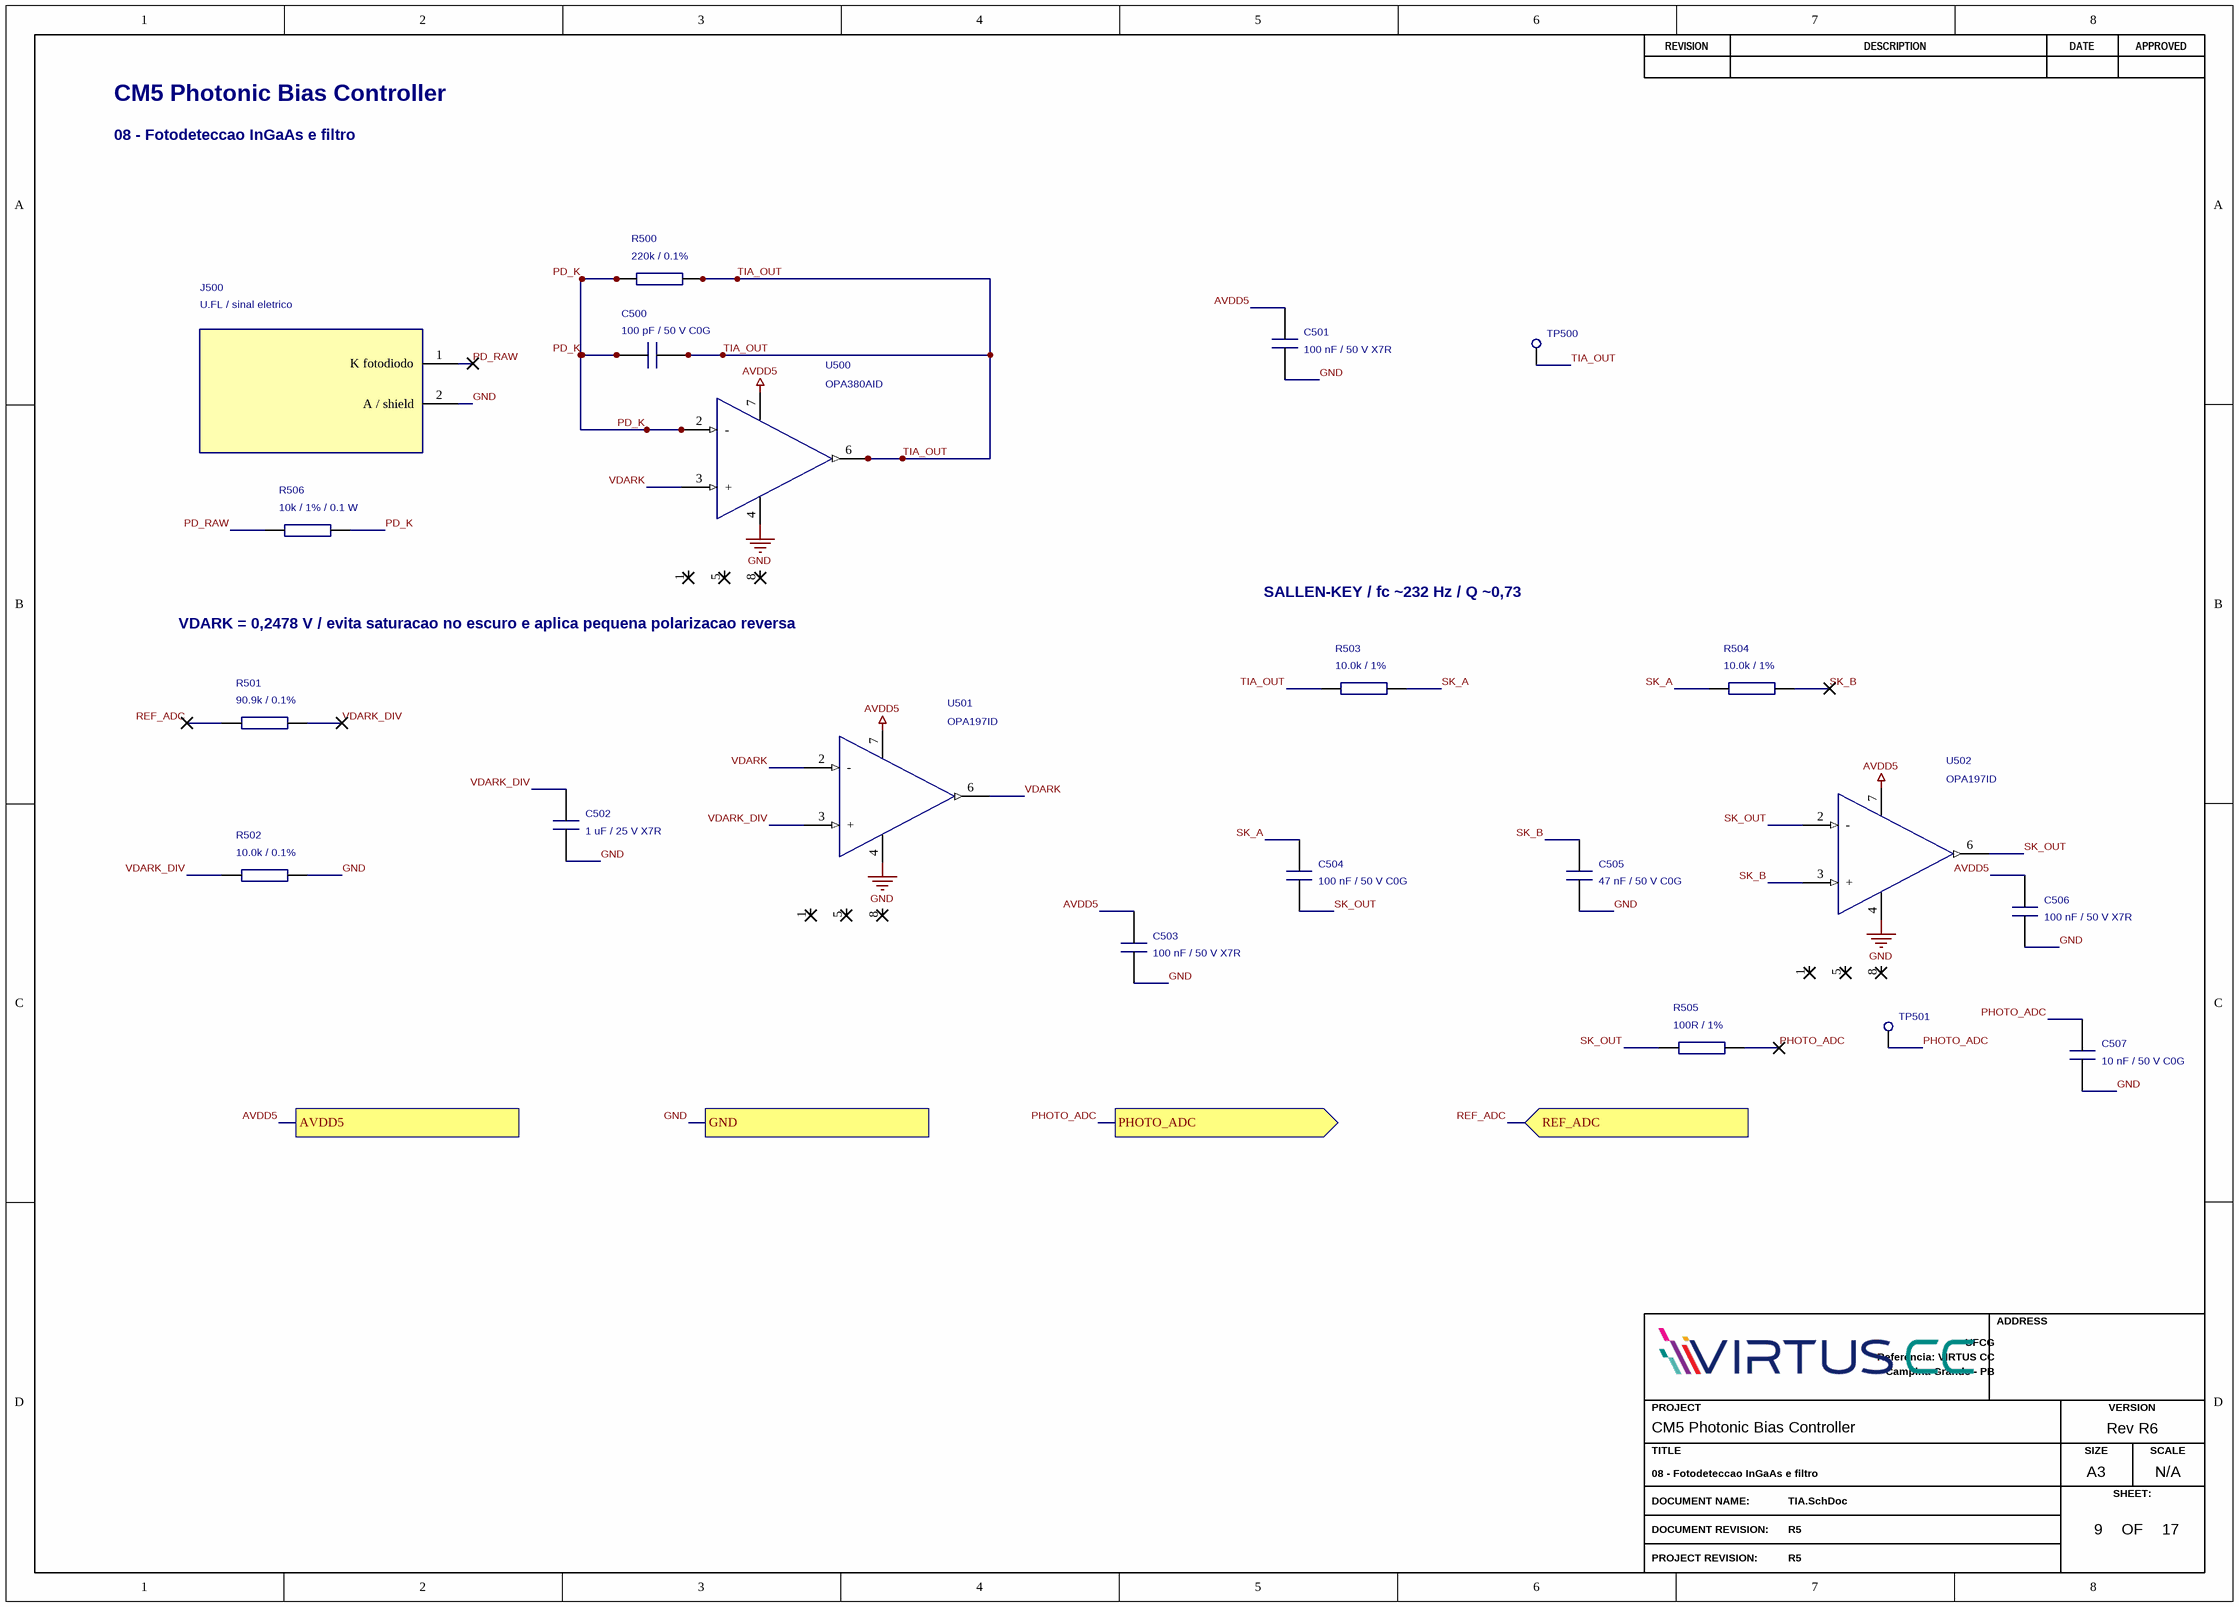
[diagram p11: TIA.SchDoc]

### Parts
C500  100 pF / 50 V C0G  [C0805]
C501  100 nF / 50 V X7R  [C0805]
C502  1 uF / 25 V X7R  [C0805]
C503  100 nF / 50 V X7R  [C0805]
C504  100 nF / 50 V C0G  [C1206]
C505  47 nF / 50 V C0G  [C1206]
C506  100 nF / 50 V X7R  [C0805]
C507  10 nF / 50 V C0G  [C0805]
J500  U.FL / sinal eletrico  [HIROSE_UFL]
R500  220k / 0.1%  [R-0603]
R501  90.9k / 0.1%  [R-0603]
R502  10.0k / 0.1%  [R-0603]
R503  10.0k / 1%  [R-0603]
R504  10.0k / 1%  [R-0603]
R505  100R / 1%  [R-0603]
R506  10k / 1% / 0.1 W  [R-0603]
TP500  Testpoint  [TP06R]  (value not drawn)
TP501  Testpoint  [TP06R]  (value not drawn)
U500  OPA380AID  [SOIC8]
U501  OPA197ID  [SOIC8]
U502  OPA197ID  [SOIC8]

### Ports
AVDD5, GND, PHOTO_ADC (out), REF_ADC (in)

### Nets
AVDD5: C501.1 C503.1 C506.1 U500.7(V+) U501.7(V+) U502.7(V+) ; port AVDD5
GND: C501.2 C502.2 C503.2 C505.2 C506.2 C507.2 J500.2(A_/_shield) R502.2 U500.4(V-) U501.4(V-) U502.4(V-) ; port GND
PD_K: C500.1 R500.1 R506.2 U500.2(-)
PD_RAW: J500.1(K_fotodiodo) R506.1
PHOTO_ADC: C507.1 R505.2 TP501.1(TP) ; port PHOTO_ADC
REF_ADC: R501.1 ; port REF_ADC
SK_A: C504.1 R503.2 R504.1
SK_B: C505.1 R504.2 U502.3(+)
SK_OUT: C504.2 R505.1 U502.2(-) U502.6(OUT)
TIA_OUT: C500.2 R500.2 R503.1 TP500.1(TP) U500.6(OUT)
VDARK: U500.3(+) U501.2(-) U501.6(OUT)
VDARK_DIV: C502.1 R501.2 R502.1 U501.3(+)

Not connected (* = marked no-connect by the designer): U500 1(NC)* 5(NC)* 8(NC)*; U501 1(NC)* 5(NC)* 8(NC)*; U502 1(NC)* 5(NC)* 8(NC)*

### Notes on the sheet
- CM5 Photonic Bias Controller
- 08 - Fotodeteccao InGaAs e filtro
- SALLEN-KEY / fc ~232 Hz / Q ~0,73
- (near U500) VDARK = 0,2478 V / evita saturacao no escuro e aplica pequena polarizacao reversa
- REVISION
- DESCRIPTION
- DATE
- APPROVED
- ADDRESS
- PROJECT
- VERSION
- TITLE
- A3
- SIZE
- SCALE
- DOCUMENT NAME:
- DOCUMENT REVISION:
- OF
- SHEET:
- PROJECT REVISION:

### Library data of the parts
C500 = 100 pF: Manufacturer: KEMET; Manufacturer Part Number: C0805C101J5GACTU; Procurement Status: Busca por MPN; SKU e disponibilidade a confirmar; BOM Purchase: Yes; Manufacturer 1: KEMET; Manufacturer Part Number 1: C0805C101J5GACTU; Supplier 1: DigiKey; Supplier URL 1: https://www.digikey.com.br/pt/products/result?keywords=C0805C101J5GACTU; Supplier 2: Mouser; Supplier URL 2: https://br.mouser.com/c/?q=C0805C101J5GACTU; Datasheet: https://www.yageogroup.com/download/specsheet/C0805C101J5GACTU
C501 C503 C506 = 100 nF: as C202 on sheet Power_Input_5V; Manufacturer 1: KEMET; Manufacturer Part Number 1: C0805C104K5RACTU; Supplier 1: DigiKey; Supplier URL 1: https://www.digikey.com.br/pt/products/result?keywords=C0805C104K5RACTU; Supplier 2: Mouser; Supplier URL 2: https://br.mouser.com/c/?q=C0805C104K5RACTU; Datasheet: https://www.yageogroup.com/download/specsheet/C0805C104K5RACTU
C502 = 1 uF: as C400 on sheet ADC; Manufacturer 1: KEMET; Manufacturer Part Number 1: C0805C105K3RACTU; Supplier 1: DigiKey; Supplier URL 1: https://www.digikey.com.br/pt/products/result?keywords=C0805C105K3RACTU; Supplier 2: Mouser; Supplier URL 2: https://br.mouser.com/c/?q=C0805C105K3RACTU; Datasheet: https://www.yageogroup.com/download/specsheet/C0805C105K3RACTU
C504 = 100 nF: Manufacturer: KEMET; Manufacturer Part Number: C1206C104J5GACTU; Procurement Status: Busca por MPN; SKU e disponibilidade a confirmar; BOM Purchase: Yes; Manufacturer 1: KEMET; Manufacturer Part Number 1: C1206C104J5GACTU; Supplier 1: DigiKey; Supplier URL 1: https://www.digikey.com.br/pt/products/result?keywords=C1206C104J5GACTU; Supplier 2: Mouser; Supplier URL 2: https://br.mouser.com/c/?q=C1206C104J5GACTU; Datasheet: https://www.yageogroup.com/download/specsheet/C1206C104J5GACTU
C505 = 47 nF: Manufacturer: KEMET; Manufacturer Part Number: C1206C473J5GACTU; Procurement Status: Busca por MPN; SKU e disponibilidade a confirmar; BOM Purchase: Yes; Manufacturer 1: KEMET; Manufacturer Part Number 1: C1206C473J5GACTU; Supplier 1: DigiKey; Supplier URL 1: https://www.digikey.com.br/pt/products/result?keywords=C1206C473J5GACTU; Supplier 2: Mouser; Supplier URL 2: https://br.mouser.com/c/?q=C1206C473J5GACTU; Datasheet: https://www.yageogroup.com/download/specsheet/C1206C473J5GACTU
C507 = 10 nF: Manufacturer: KEMET; Manufacturer Part Number: C0805C103J5GACTU; Procurement Status: Busca por MPN; SKU e disponibilidade a confirmar; BOM Purchase: Yes; Manufacturer 1: KEMET; Manufacturer Part Number 1: C0805C103J5GACTU; Supplier 1: DigiKey; Supplier URL 1: https://www.digikey.com.br/pt/products/result?keywords=C0805C103J5GACTU; Supplier 2: Mouser; Supplier URL 2: https://br.mouser.com/c/?q=C0805C103J5GACTU; Datasheet: https://www.yageogroup.com/download/specsheet/C0805C103J5GACTU
J500 = U.FL: Manufacturer: Hirose; Manufacturer Part Number: U.FL-R-SMT-1(10); Review: Centro=1; pads de blindagem=2; conector eletrico do fotodiodo externo.; Procurement Status: Busca por MPN; SKU e disponibilidade a confirmar; BOM Purchase: Yes; Manufacturer 1: Hirose; Manufacturer Part Number 1: U.FL-R-SMT-1(10); Supplier 1: DigiKey; Supplier URL 1: https://www.digikey.com.br/pt/products/result?keywords=U.FL-R-SMT-1%2810%29; Supplier 2: Mouser; Supplier URL 2: https://br.mouser.com/c/?q=U.FL-R-SMT-1%2810%29; Datasheet: https://www.hirose.com/product/series/U.FL
R500 = 220k: Manufacturer: YAGEO; Manufacturer Part Number: RT0603BRD07220KL; Review: Filme fino, 0,1%, 25 ppm/K; 0,1 W. Verificar dissipacao em R210/R212 e matching dos drivers.; Procurement Status: Busca por MPN; SKU e disponibilidade a confirmar; BOM Purchase: Yes; Manufacturer 1: YAGEO; Manufacturer Part Number 1: RT0603BRD07220KL; Supplier 1: DigiKey; Supplier URL 1: https://www.digikey.com.br/pt/products/result?keywords=RT0603BRD07220KL; Supplier 2: Mouser; Supplier URL 2: https://br.mouser.com/c/?q=RT0603BRD07220KL; Datasheet: https://www.yageo.com/en/Product/Index/rchip
R501 = 90.9k: Manufacturer: YAGEO; Manufacturer Part Number: RT0603BRD0790K9L; Review: Filme fino, 0,1%, 25 ppm/K; 0,1 W. Verificar dissipacao em R210/R212 e matching dos drivers.; Procurement Status: SKU conferido; consultar disponibilidade; BOM Purchase: Yes; Manufacturer 1: YAGEO; Manufacturer Part Number 1: RT0603BRD0790K9L; Supplier 1: DigiKey; Supplier Part Number 1: YAG1747CT-ND; Supplier URL 1: https://www.digikey.com.br/en/products/detail/yageo/RT0603BRD0790K9L/1072677; Supplier 2: Mouser; Supplier URL 2: https://br.mouser.com/c/?q=RT0603BRD0790K9L; Datasheet: https://www.yageo.com/en/Product/Index/rchip
R502 = 10.0k: Manufacturer: YAGEO; Manufacturer Part Number: RT0603BRD0710KL; Review: Filme fino, 0,1%, 25 ppm/K; 0,1 W. Verificar dissipacao em R210/R212 e matching dos drivers.; Procurement Status: Busca por MPN; SKU e disponibilidade a confirmar; BOM Purchase: Yes; Manufacturer 1: YAGEO; Manufacturer Part Number 1: RT0603BRD0710KL; Supplier 1: DigiKey; Supplier URL 1: https://www.digikey.com.br/pt/products/result?keywords=RT0603BRD0710KL; Supplier 2: Mouser; Supplier URL 2: https://br.mouser.com/c/?q=RT0603BRD0710KL; Datasheet: https://www.yageo.com/en/Product/Index/rchip
R503 R504 = 10.0k: Manufacturer: YAGEO; Manufacturer Part Number: RC0603FR-0710KL; Procurement Status: Busca por MPN; SKU e disponibilidade a confirmar; BOM Purchase: Yes; Manufacturer 1: YAGEO; Manufacturer Part Number 1: RC0603FR-0710KL; Supplier 1: DigiKey; Supplier URL 1: https://www.digikey.com.br/pt/products/result?keywords=RC0603FR-0710KL; Supplier 2: Mouser; Supplier URL 2: https://br.mouser.com/c/?q=RC0603FR-0710KL; Datasheet: https://www.yageo.com/en/Product/Index/rchip
R505 = 100R: Manufacturer: YAGEO; Manufacturer Part Number: RC0603FR-07100RL; Procurement Status: Busca por MPN; SKU e disponibilidade a confirmar; BOM Purchase: Yes; Manufacturer 1: YAGEO; Manufacturer Part Number 1: RC0603FR-07100RL; Supplier 1: DigiKey; Supplier URL 1: https://www.digikey.com.br/pt/products/result?keywords=RC0603FR-07100RL; Supplier 2: Mouser; Supplier URL 2: https://br.mouser.com/c/?q=RC0603FR-07100RL; Datasheet: https://www.yageo.com/en/Product/Index/rchip
R506 = 10k: as R102 on sheet CM5_Boot_USB; Manufacturer 1: YAGEO; Manufacturer Part Number 1: RC0603FR-0710KL; Supplier 1: DigiKey; Supplier URL 1: https://www.digikey.com.br/pt/products/result?keywords=RC0603FR-0710KL; Supplier 2: Mouser; Supplier URL 2: https://br.mouser.com/c/?q=RC0603FR-0710KL; Datasheet: https://www.yageo.com/en/Product/Index/rchip
TP500 TP501 = Testpoint: as TP100 on sheet CM5_HighSpeed
U500 = OPA380AID: Manufacturer: Texas Instruments; Procurement Status: Busca por MPN; SKU e disponibilidade a confirmar; BOM Purchase: Yes; Manufacturer Part Number: OPA380AID; Manufacturer 1: Texas Instruments; Manufacturer Part Number 1: OPA380AID; Supplier 1: DigiKey; Supplier URL 1: https://www.digikey.com.br/pt/products/result?keywords=OPA380AID; Supplier 2: Mouser; Supplier URL 2: https://br.mouser.com/c/?q=OPA380AID; Datasheet: https://www.ti.com/lit/ds/symlink/opa380.pdf
U501 U502 = OPA197ID: Manufacturer: Texas Instruments; Procurement Status: Busca por MPN; SKU e disponibilidade a confirmar; BOM Purchase: Yes; Manufacturer Part Number: OPA197ID; Manufacturer 1: Texas Instruments; Manufacturer Part Number 1: OPA197ID; Supplier 1: DigiKey; Supplier URL 1: https://www.digikey.com.br/pt/products/result?keywords=OPA197ID; Supplier 2: Mouser; Supplier URL 2: https://br.mouser.com/c/?q=OPA197ID; Datasheet: https://www.ti.com/lit/ds/symlink/opa197.pdf

## Sheet DAC_Reference.SchDoc: 09 - DAC de quatro canais e referencia de offset
size A3; Project: CM5 Photonic Bias Controller; DocumentRev: R5; ProjectRev: R5; Version: Rev R6; SheetNumber: 10; SheetTotal: 17; Author: Carlos Renan; SCH_SCALE: N/A; Address1: UFCG; Address2: Referencia: VIRTUS CC; Address3: Campina Grande - PB; ProjectName: Controle automatico de BIAS para MZM/IQ - Projeto 3; DocumentName: DAC_Reference.SchDoc
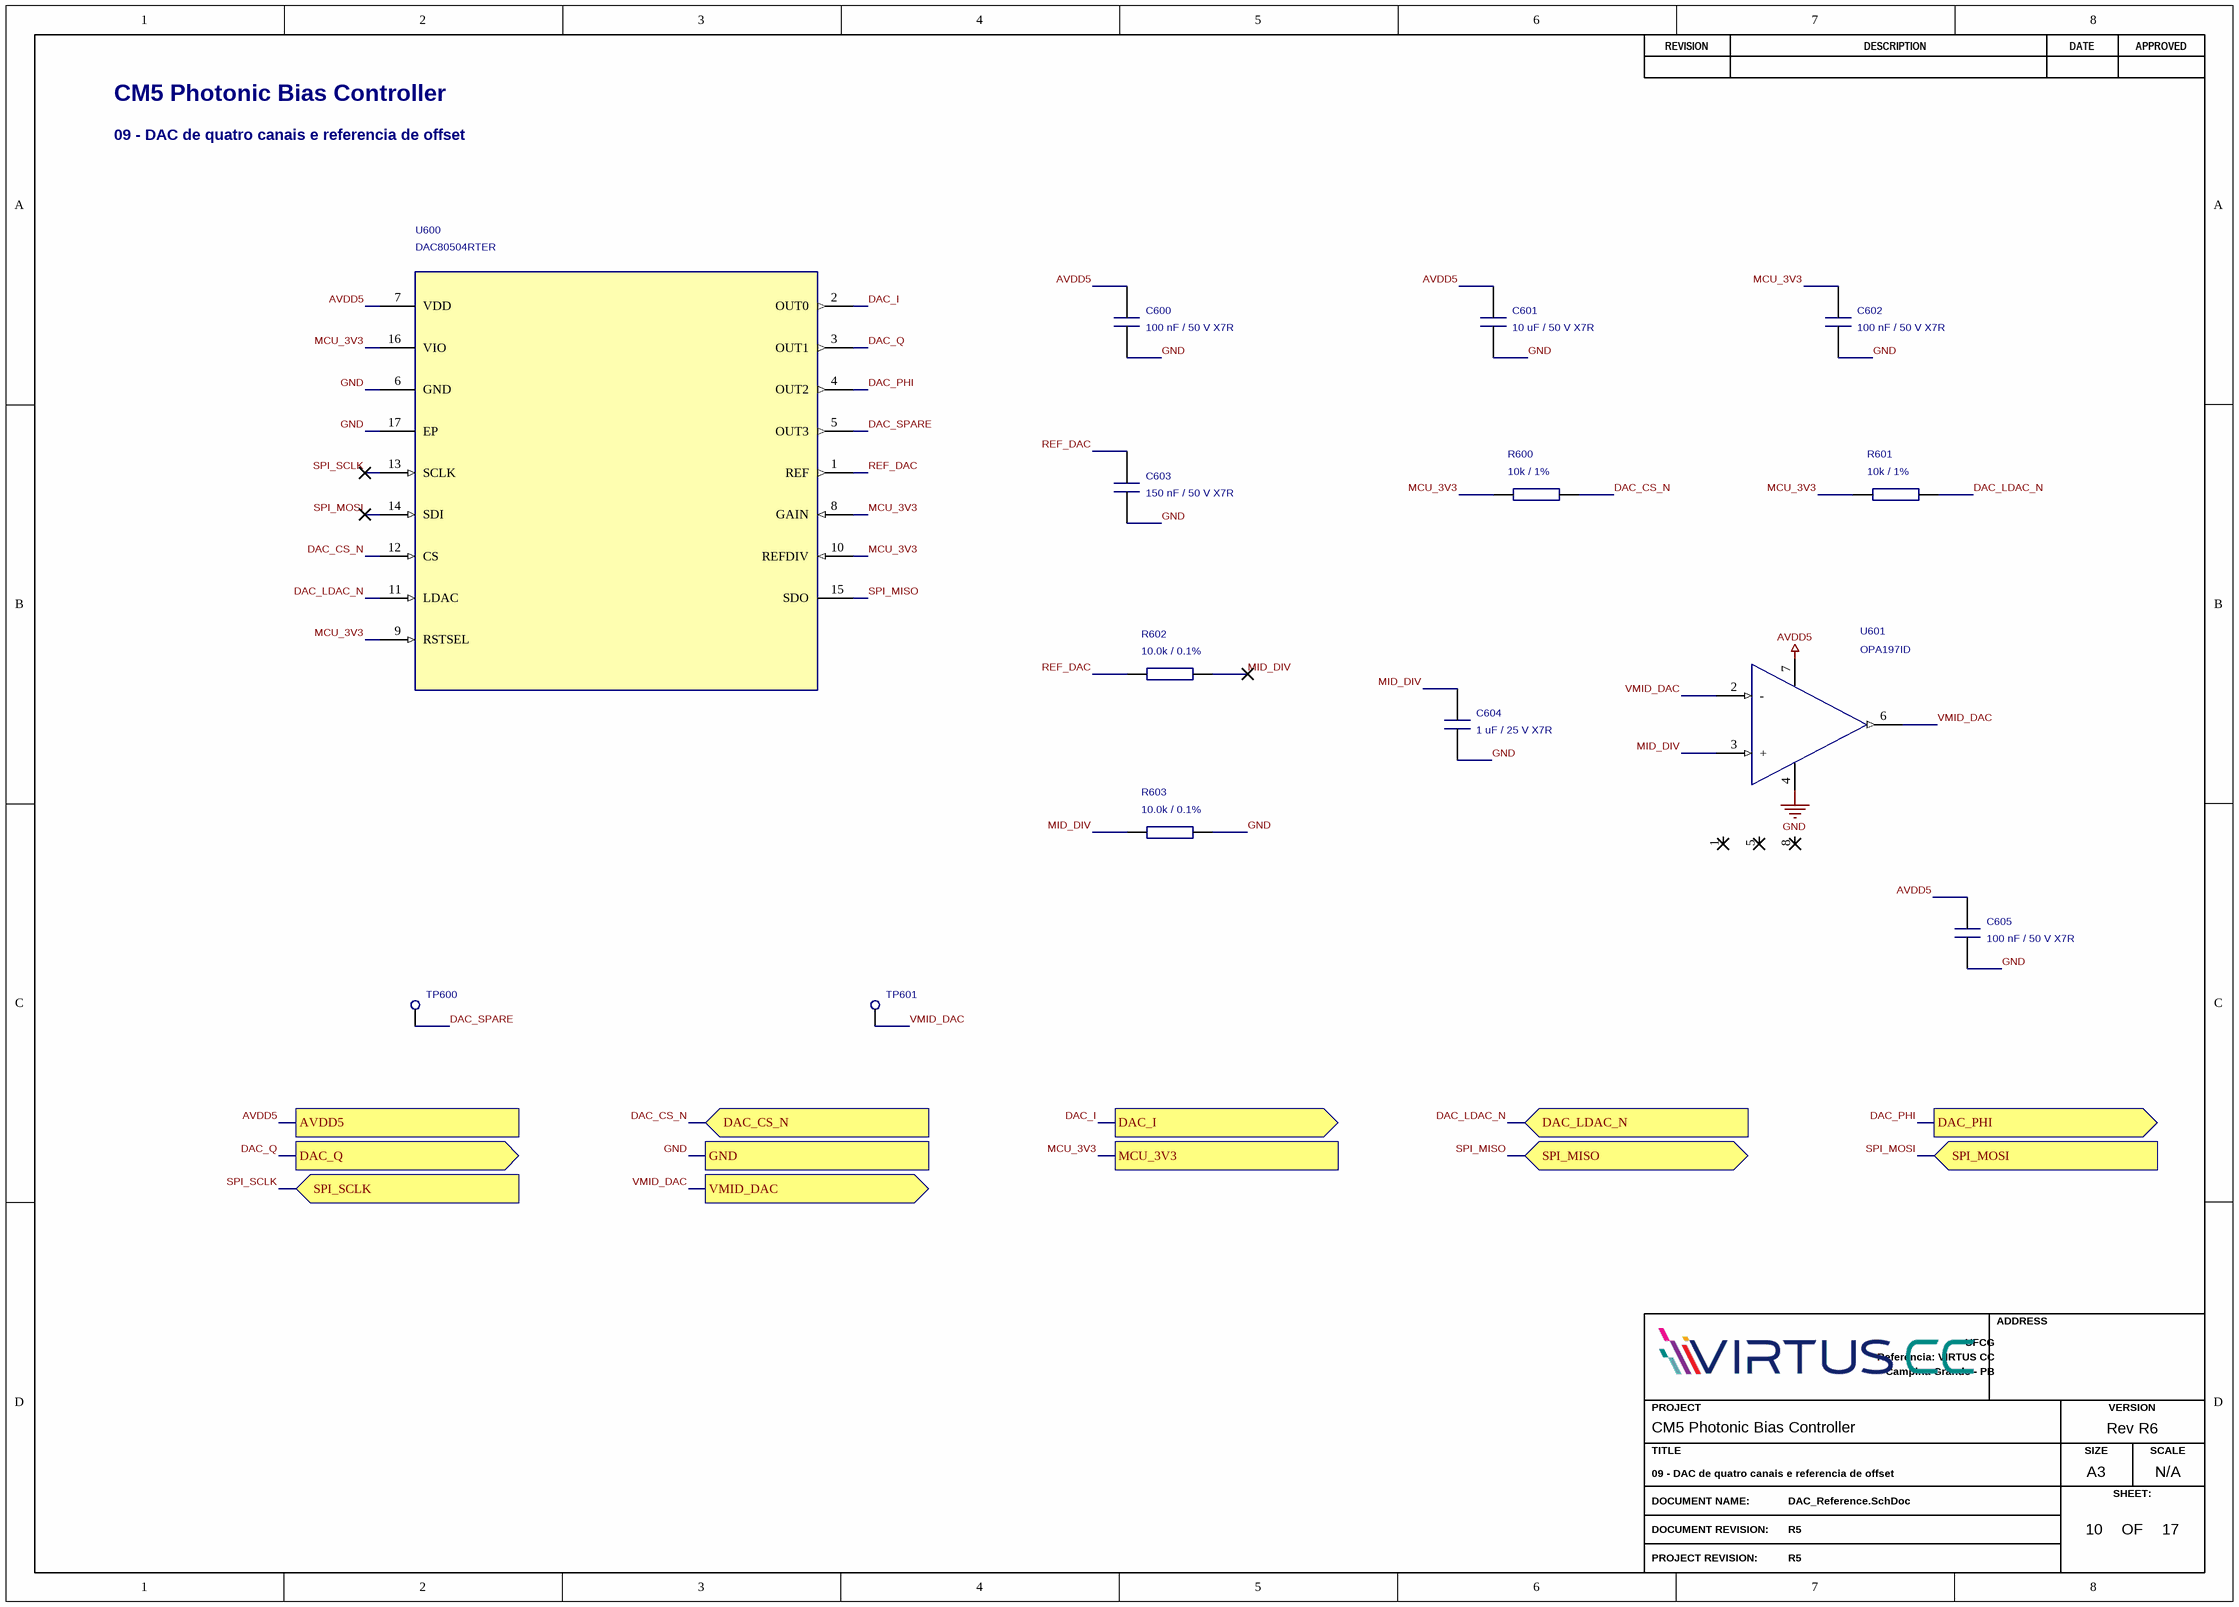
[diagram p12: DAC_Reference.SchDoc]

### Parts
C600  100 nF / 50 V X7R  [C0805]
C601  10 uF / 50 V X7R  [C1210]
C602  100 nF / 50 V X7R  [C0805]
C603  150 nF / 50 V X7R  [C1206]
C604  1 uF / 25 V X7R  [C0805]
C605  100 nF / 50 V X7R  [C0805]
R600  10k / 1%  [R-0603]
R601  10k / 1%  [R-0603]
R602  10.0k / 0.1%  [R-0603]
R603  10.0k / 0.1%  [R-0603]
TP600  Testpoint  [TP06R]  (value not drawn)
TP601  Testpoint  [TP06R]  (value not drawn)
U600  DAC80504RTER  [DAC80504_RTE]
U601  OPA197ID  [SOIC8]

### Ports
AVDD5, DAC_CS_N (in), DAC_I (out), DAC_LDAC_N (in), DAC_PHI (out), DAC_Q (out), GND, MCU_3V3, SPI_MISO (bidir), SPI_MOSI (in), SPI_SCLK (in), VMID_DAC (out)

### Nets
AVDD5: C600.1 C601.1 C605.1 U600.7(VDD) U601.7(V+) ; port AVDD5
GND: C600.2 C601.2 C602.2 C603.2 C604.2 C605.2 R603.2 U600.6(GND) U600.17(EP) U601.4(V-) ; port GND
DAC_CS_N: R600.2 U600.12(CS) ; port DAC_CS_N
DAC_I: U600.2(OUT0) ; port DAC_I
DAC_LDAC_N: R601.2 U600.11(LDAC) ; port DAC_LDAC_N
DAC_PHI: U600.4(OUT2) ; port DAC_PHI
DAC_Q: U600.3(OUT1) ; port DAC_Q
DAC_SPARE: TP600.1(TP) U600.5(OUT3)
MCU_3V3: C602.1 R600.1 R601.1 U600.8(GAIN) U600.9(RSTSEL) U600.10(REFDIV) U600.16(VIO) ; port MCU_3V3
MID_DIV: C604.1 R602.2 R603.1 U601.3(+)
REF_DAC: C603.1 R602.1 U600.1(REF)
SPI_MISO: U600.15(SDO) ; port SPI_MISO
SPI_MOSI: U600.14(SDI) ; port SPI_MOSI
SPI_SCLK: U600.13(SCLK) ; port SPI_SCLK
VMID_DAC: TP601.1(TP) U601.2(-) U601.6(OUT) ; port VMID_DAC

Not connected (* = marked no-connect by the designer): U601 1(NC)* 5(NC)* 8(NC)*

### Notes on the sheet
- CM5 Photonic Bias Controller
- 09 - DAC de quatro canais e referencia de offset
- REVISION
- DESCRIPTION
- DATE
- APPROVED
- ADDRESS
- PROJECT
- VERSION
- TITLE
- A3
- SIZE
- SCALE
- DOCUMENT NAME:
- DOCUMENT REVISION:
- OF
- SHEET:
- PROJECT REVISION:

### Library data of the parts
C600 C602 C605 = 100 nF: as C202 on sheet Power_Input_5V; Manufacturer 1: KEMET; Manufacturer Part Number 1: C0805C104K5RACTU; Supplier 1: DigiKey; Supplier URL 1: https://www.digikey.com.br/pt/products/result?keywords=C0805C104K5RACTU; Supplier 2: Mouser; Supplier URL 2: https://br.mouser.com/c/?q=C0805C104K5RACTU; Datasheet: https://www.yageogroup.com/download/specsheet/C0805C104K5RACTU
C601 = 10 uF: as C300 on sheet MCU_RP2040; Manufacturer 1: KEMET; Manufacturer Part Number 1: C1210C106K5RACTU; Supplier 1: DigiKey; Supplier URL 1: https://www.digikey.com.br/pt/products/result?keywords=C1210C106K5RACTU; Supplier 2: Mouser; Supplier URL 2: https://br.mouser.com/c/?q=C1210C106K5RACTU; Datasheet: https://www.yageogroup.com/download/specsheet/C1210C106K5RACTU
C603 = 150 nF: Manufacturer: KEMET; Manufacturer Part Number: C1206C154K5RACTU; Review: X7R no bypass da referencia; nao participa do polo Sallen-Key. Capacitancia nominal 150 nF.; Procurement Status: Busca por MPN; SKU e disponibilidade a confirmar; BOM Purchase: Yes; Manufacturer 1: KEMET; Manufacturer Part Number 1: C1206C154K5RACTU; Supplier 1: DigiKey; Supplier URL 1: https://www.digikey.com.br/pt/products/result?keywords=C1206C154K5RACTU; Supplier 2: Mouser; Supplier URL 2: https://br.mouser.com/c/?q=C1206C154K5RACTU; Datasheet: https://www.yageogroup.com/download/specsheet/C1206C154K5RACTU
C604 = 1 uF: as C400 on sheet ADC; Manufacturer 1: KEMET; Manufacturer Part Number 1: C0805C105K3RACTU; Supplier 1: DigiKey; Supplier URL 1: https://www.digikey.com.br/pt/products/result?keywords=C0805C105K3RACTU; Supplier 2: Mouser; Supplier URL 2: https://br.mouser.com/c/?q=C0805C105K3RACTU; Datasheet: https://www.yageogroup.com/download/specsheet/C0805C105K3RACTU
R600 R601 = 10k: as R102 on sheet CM5_Boot_USB; Manufacturer 1: YAGEO; Manufacturer Part Number 1: RC0603FR-0710KL; Supplier 1: DigiKey; Supplier URL 1: https://www.digikey.com.br/pt/products/result?keywords=RC0603FR-0710KL; Supplier 2: Mouser; Supplier URL 2: https://br.mouser.com/c/?q=RC0603FR-0710KL; Datasheet: https://www.yageo.com/en/Product/Index/rchip
R602 R603 = 10.0k: as R502 on sheet TIA; Manufacturer 1: YAGEO; Manufacturer Part Number 1: RT0603BRD0710KL; Supplier 1: DigiKey; Supplier URL 1: https://www.digikey.com.br/pt/products/result?keywords=RT0603BRD0710KL; Supplier 2: Mouser; Supplier URL 2: https://br.mouser.com/c/?q=RT0603BRD0710KL; Datasheet: https://www.yageo.com/en/Product/Index/rchip
TP600 TP601 = Testpoint: as TP100 on sheet CM5_HighSpeed
U600 = DAC80504RTER: Manufacturer: Texas Instruments; Procurement Status: Busca por MPN; SKU e disponibilidade a confirmar; BOM Purchase: Yes; Manufacturer Part Number: DAC80504RTER; Manufacturer 1: Texas Instruments; Manufacturer Part Number 1: DAC80504RTER; Supplier 1: DigiKey; Supplier URL 1: https://www.digikey.com.br/pt/products/result?keywords=DAC80504RTER; Supplier 2: Mouser; Supplier URL 2: https://br.mouser.com/c/?q=DAC80504RTER; Datasheet: https://www.ti.com/lit/ds/symlink/dac80504.pdf
U601 = OPA197ID: as U501 on sheet TIA; Manufacturer Part Number: OPA197ID; Manufacturer 1: Texas Instruments; Manufacturer Part Number 1: OPA197ID; Supplier 1: DigiKey; Supplier URL 1: https://www.digikey.com.br/pt/products/result?keywords=OPA197ID; Supplier 2: Mouser; Supplier URL 2: https://br.mouser.com/c/?q=OPA197ID; Datasheet: https://www.ti.com/lit/ds/symlink/opa197.pdf

## Sheet Bias_I.SchDoc: 10 - Canal de BIAS I / MZM simples
size A3; Project: CM5 Photonic Bias Controller; DocumentRev: R5; ProjectRev: R5; Version: Rev R6; SheetNumber: 11; SheetTotal: 17; Author: Carlos Renan; SCH_SCALE: N/A; Address1: UFCG; Address2: Referencia: VIRTUS CC; Address3: Campina Grande - PB; ProjectName: Controle automatico de BIAS para MZM/IQ - Projeto 3; DocumentName: Bias_I.SchDoc
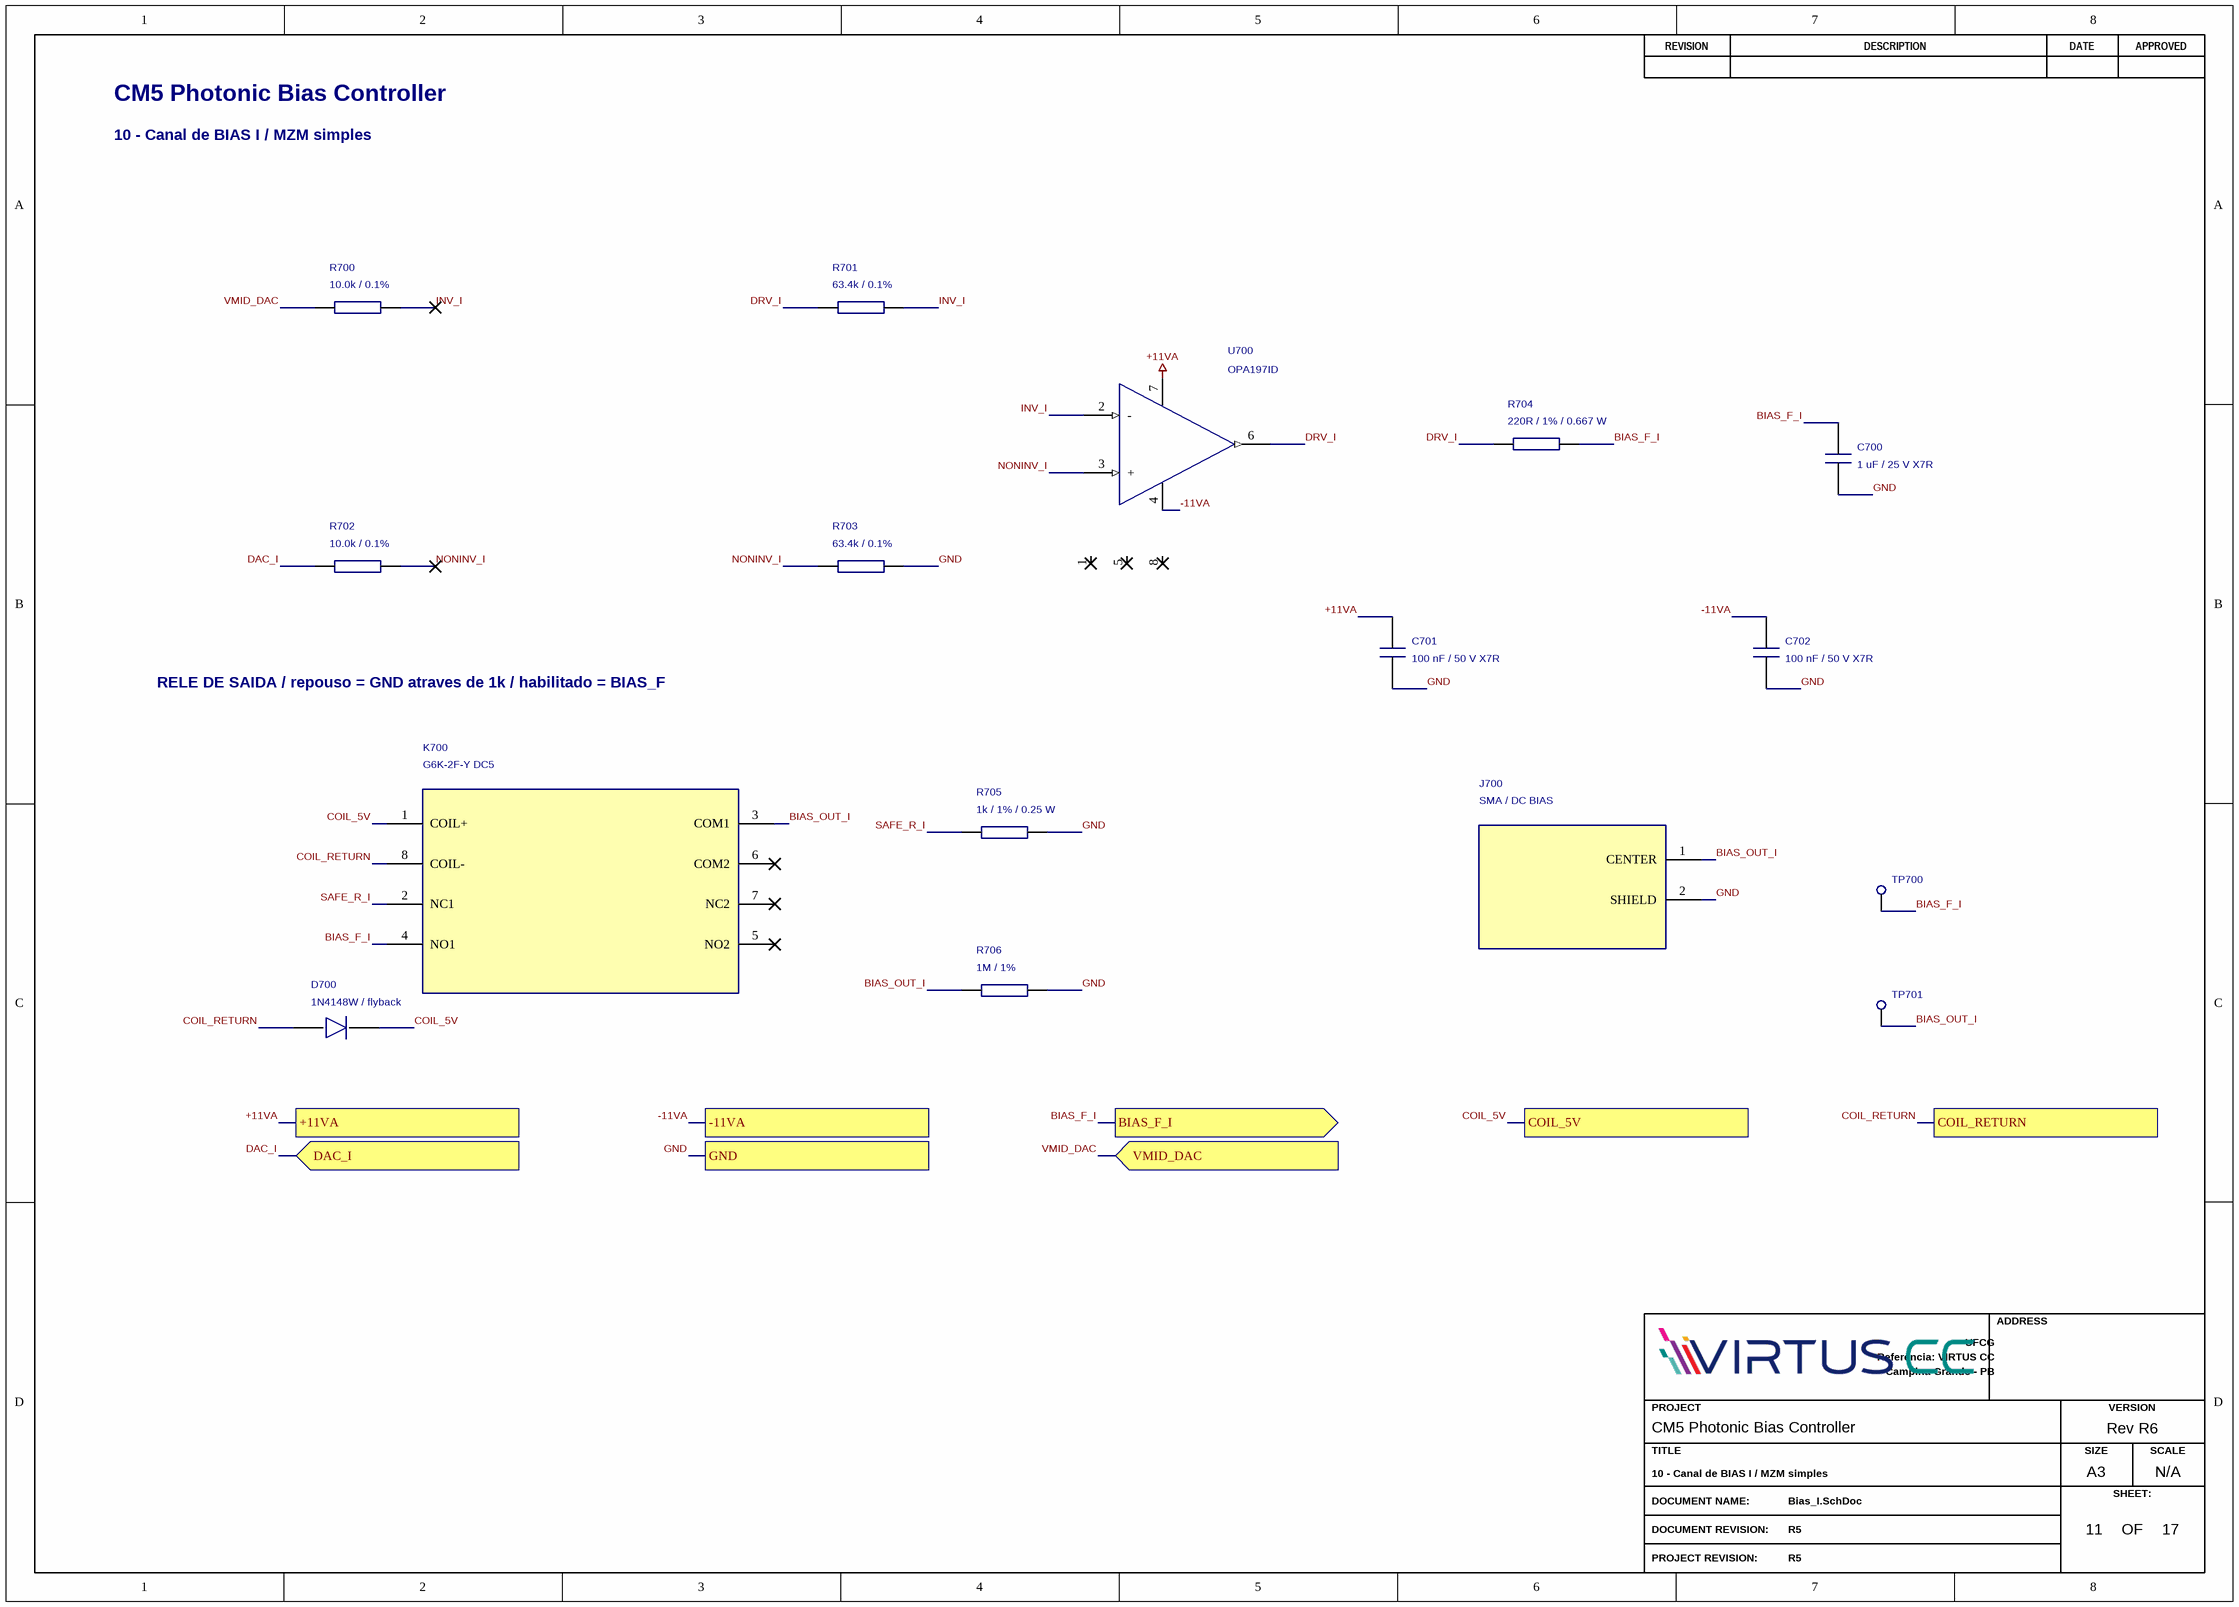
[diagram p13: Bias_I.SchDoc]

### Parts
C700  1 uF / 25 V X7R  [C0805]
C701  100 nF / 50 V X7R  [C0805]
C702  100 nF / 50 V X7R  [C0805]
D700  1N4148W / flyback  [SOD-123]
J700  SMA / DC BIAS  [SMA_132134]
K700  G6K-2F-Y DC5  [G6K_2F_Y]
R700  10.0k / 0.1%  [R-0603]
R701  63.4k / 0.1%  [R-0603]
R702  10.0k / 0.1%  [R-0603]
R703  63.4k / 0.1%  [R-0603]
R704  220R / 1% / 0.667 W  [R1206]
R705  1k / 1% / 0.25 W  [R1206]
R706  1M / 1%  [R-0603]
TP700  Testpoint  [TP06R]  (value not drawn)
TP701  Testpoint  [TP06R]  (value not drawn)
U700  OPA197ID  [SOIC8]

### Ports
+11VA, -11VA, BIAS_F_I (out), COIL_5V, COIL_RETURN, DAC_I (in), GND, VMID_DAC (in)

### Nets
+11VA: C701.1 U700.7(V+) ; port +11VA
GND: C700.2 C701.2 C702.2 J700.2(SHIELD) R703.2 R705.2 R706.2 ; port GND
-11VA: C702.1 U700.4(V-) ; port -11VA
BIAS_F_I: C700.1 K700.4(NO1) R704.2 TP700.1(TP) ; port BIAS_F_I
BIAS_OUT_I: J700.1(CENTER) K700.3(COM1) R706.1 TP701.1(TP)
COIL_5V: D700.1(K) K700.1(COIL+) ; port COIL_5V
COIL_RETURN: D700.2(A) K700.8(COIL-) ; port COIL_RETURN
DAC_I: R702.1 ; port DAC_I
DRV_I: R701.1 R704.1 U700.6(OUT)
INV_I: R700.2 R701.2 U700.2(-)
NONINV_I: R702.2 R703.1 U700.3(+)
SAFE_R_I: K700.2(NC1) R705.1
VMID_DAC: R700.1 ; port VMID_DAC

Not connected (* = marked no-connect by the designer): K700 5(NO2)* 6(COM2)* 7(NC2)*; U700 1(NC)* 5(NC)* 8(NC)*

### Notes on the sheet
- CM5 Photonic Bias Controller
- 10 - Canal de BIAS I / MZM simples
- RELE DE SAIDA / repouso = GND atraves de 1k / habilitado = BIAS_F
- REVISION
- DESCRIPTION
- DATE
- APPROVED
- ADDRESS
- PROJECT
- VERSION
- TITLE
- A3
- SIZE
- SCALE
- DOCUMENT NAME:
- DOCUMENT REVISION:
- OF
- SHEET:
- PROJECT REVISION:

### Library data of the parts
C700 = 1 uF: Manufacturer: KEMET; Manufacturer Part Number: C0805C105K3RACTU; Procurement Status: Busca por MPN; SKU e disponibilidade a confirmar; BOM Purchase: Yes; Manufacturer 1: KEMET; Manufacturer Part Number 1: C0805C105K3RACTU; Supplier 1: DigiKey; Supplier URL 1: https://www.digikey.com.br/pt/products/result?keywords=C0805C105K3RACTU; Supplier 2: Mouser; Supplier URL 2: https://br.mouser.com/c/?q=C0805C105K3RACTU; Datasheet: https://www.yageogroup.com/download/specsheet/C0805C105K3RACTU
C701 C702 = 100 nF: Manufacturer: KEMET; Manufacturer Part Number: C0805C104K5RACTU; Procurement Status: Busca por MPN; SKU e disponibilidade a confirmar; BOM Purchase: Yes; Manufacturer 1: KEMET; Manufacturer Part Number 1: C0805C104K5RACTU; Supplier 1: DigiKey; Supplier URL 1: https://www.digikey.com.br/pt/products/result?keywords=C0805C104K5RACTU; Supplier 2: Mouser; Supplier URL 2: https://br.mouser.com/c/?q=C0805C104K5RACTU; Datasheet: https://www.yageogroup.com/download/specsheet/C0805C104K5RACTU
D700 = 1N4148W: Manufacturer: Diodes Incorporated; Manufacturer Part Number: 1N4148W-7-F; Procurement Status: Busca por MPN; SKU e disponibilidade a confirmar; BOM Purchase: Yes; Manufacturer 1: Diodes Incorporated; Manufacturer Part Number 1: 1N4148W-7-F; Supplier 1: DigiKey; Supplier URL 1: https://www.digikey.com.br/pt/products/result?keywords=1N4148W-7-F; Supplier 2: Mouser; Supplier URL 2: https://br.mouser.com/c/?q=1N4148W-7-F; Datasheet: https://www.diodes.com/datasheet/download/1N4148W.pdf
J700 = SMA: Manufacturer: Amphenol RF; Manufacturer Part Number: 132134; Procurement Status: Busca por MPN; SKU e disponibilidade a confirmar; BOM Purchase: Yes; Manufacturer 1: Amphenol RF; Manufacturer Part Number 1: 132134; Supplier 1: DigiKey; Supplier URL 1: https://www.digikey.com.br/pt/products/result?keywords=132134; Supplier 2: Mouser; Supplier URL 2: https://br.mouser.com/c/?q=132134; Datasheet: https://www.amphenolrf.com/132134.html
K700 = G6K-2F-Y DC5: Manufacturer: Omron; Review: Bobina 1 positivo e 8 negativo; contato NC1=2, COM1=3, NO1=4.; Procurement Status: Busca por MPN; SKU e disponibilidade a confirmar; BOM Purchase: Yes; Manufacturer Part Number: G6K-2F-Y DC5; Manufacturer 1: Omron; Manufacturer Part Number 1: G6K-2F-Y DC5; Supplier 1: DigiKey; Supplier URL 1: https://www.digikey.com.br/pt/products/result?keywords=G6K-2F-Y%20DC5; Supplier 2: Mouser; Supplier URL 2: https://br.mouser.com/c/?q=G6K-2F-Y%20DC5; Datasheet: https://components.omron.com/us-en/datasheet_pdf/J156-E1.pdf
R700 R702 = 10.0k: Manufacturer: YAGEO; Manufacturer Part Number: RT0603BRD0710KL; Review: Filme fino, 0,1%, 25 ppm/K; 0,1 W. Verificar dissipacao em R210/R212 e matching dos drivers.; Procurement Status: Busca por MPN; SKU e disponibilidade a confirmar; BOM Purchase: Yes; Manufacturer 1: YAGEO; Manufacturer Part Number 1: RT0603BRD0710KL; Supplier 1: DigiKey; Supplier URL 1: https://www.digikey.com.br/pt/products/result?keywords=RT0603BRD0710KL; Supplier 2: Mouser; Supplier URL 2: https://br.mouser.com/c/?q=RT0603BRD0710KL; Datasheet: https://www.yageo.com/en/Product/Index/rchip
R701 R703 = 63.4k: Manufacturer: YAGEO; Manufacturer Part Number: RT0603BRD0763K4L; Review: Filme fino, 0,1%, 25 ppm/K; 0,1 W. Verificar dissipacao em R210/R212 e matching dos drivers.; Procurement Status: Busca por MPN; SKU e disponibilidade a confirmar; BOM Purchase: Yes; Manufacturer 1: YAGEO; Manufacturer Part Number 1: RT0603BRD0763K4L; Supplier 1: DigiKey; Supplier URL 1: https://www.digikey.com.br/pt/products/result?keywords=RT0603BRD0763K4L; Supplier 2: Mouser; Supplier URL 2: https://br.mouser.com/c/?q=RT0603BRD0763K4L; Datasheet: https://www.yageo.com/en/Product/Index/rchip
R704 = 220R: Manufacturer: Panasonic Industry; Manufacturer Part Number: ERJ-P08F2200V; Procurement Status: SKU conferido; consultar disponibilidade; BOM Purchase: Yes; Manufacturer 1: Panasonic Industry; Manufacturer Part Number 1: ERJ-P08F2200V; Supplier 1: DigiKey; Supplier Part Number 1: 10-ERJ-P08F2200VCT-ND; Supplier URL 1: https://www.digikey.com/en/products/detail/panasonic-industry/ERJ-P08F2200V/9812789; Supplier 2: Mouser; Supplier URL 2: https://br.mouser.com/c/?q=ERJ-P08F2200V; Datasheet: https://industrial.panasonic.com/cdbs/www-data/pdf/RDA0000/AOA0000C304.pdf
R705 = 1.00k: Manufacturer: YAGEO; Manufacturer Part Number: RC1206FR-071KL; Procurement Status: Busca por MPN; SKU e disponibilidade a confirmar; BOM Purchase: Yes; Manufacturer 1: YAGEO; Manufacturer Part Number 1: RC1206FR-071KL; Supplier 1: DigiKey; Supplier URL 1: https://www.digikey.com.br/pt/products/result?keywords=RC1206FR-071KL; Supplier 2: Mouser; Supplier URL 2: https://br.mouser.com/c/?q=RC1206FR-071KL; Datasheet: https://www.yageo.com/en/Product/Index/rchip
R706 = 1M: Manufacturer: YAGEO; Manufacturer Part Number: RC0603FR-071ML; Procurement Status: Busca por MPN; SKU e disponibilidade a confirmar; BOM Purchase: Yes; Manufacturer 1: YAGEO; Manufacturer Part Number 1: RC0603FR-071ML; Supplier 1: DigiKey; Supplier URL 1: https://www.digikey.com.br/pt/products/result?keywords=RC0603FR-071ML; Supplier 2: Mouser; Supplier URL 2: https://br.mouser.com/c/?q=RC0603FR-071ML; Datasheet: https://www.yageo.com/en/Product/Index/rchip
TP700 TP701 = Testpoint: Review: Testpoint em cobre; excluido da BOM de compra.; Procurement Status: Recurso de cobre da PCB; nao comprar; BOM Purchase: No - PCB feature
U700 = OPA197ID: Manufacturer: Texas Instruments; Procurement Status: Busca por MPN; SKU e disponibilidade a confirmar; BOM Purchase: Yes; Manufacturer Part Number: OPA197ID; Manufacturer 1: Texas Instruments; Manufacturer Part Number 1: OPA197ID; Supplier 1: DigiKey; Supplier URL 1: https://www.digikey.com.br/pt/products/result?keywords=OPA197ID; Supplier 2: Mouser; Supplier URL 2: https://br.mouser.com/c/?q=OPA197ID; Datasheet: https://www.ti.com/lit/ds/symlink/opa197.pdf